# Altium project PCB-MAIN.PrjPcb (part 1 of 3)
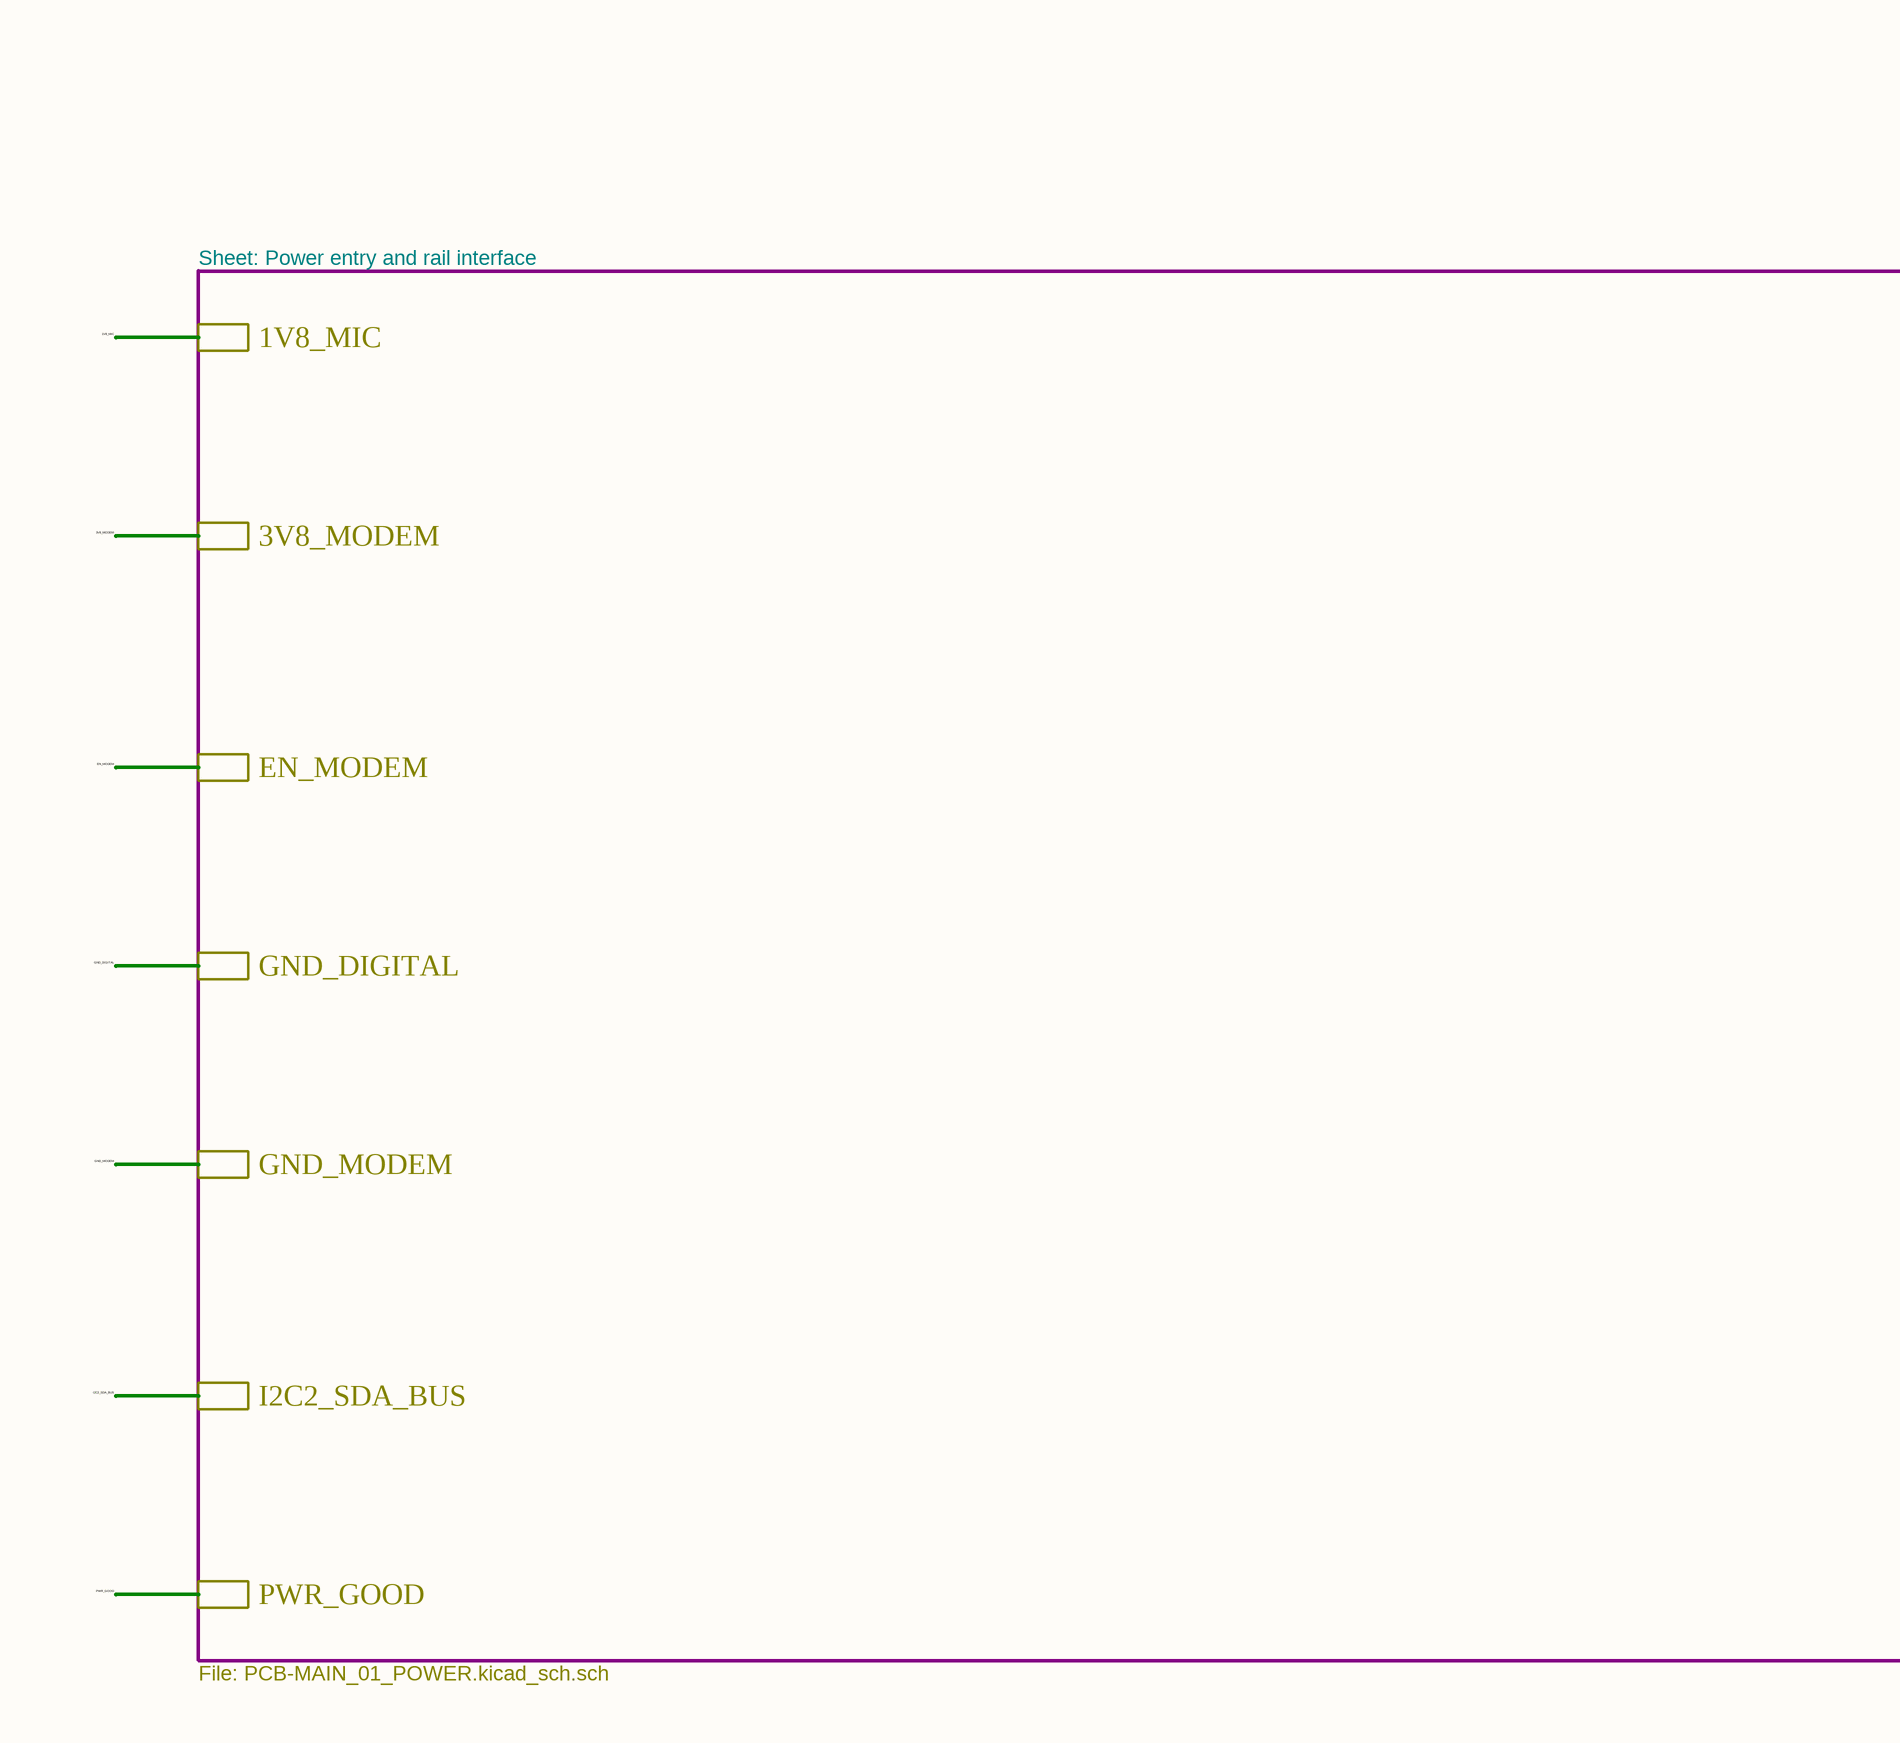
[diagram p0: PCB-MAIN.SchDoc, top column 1 of 4]
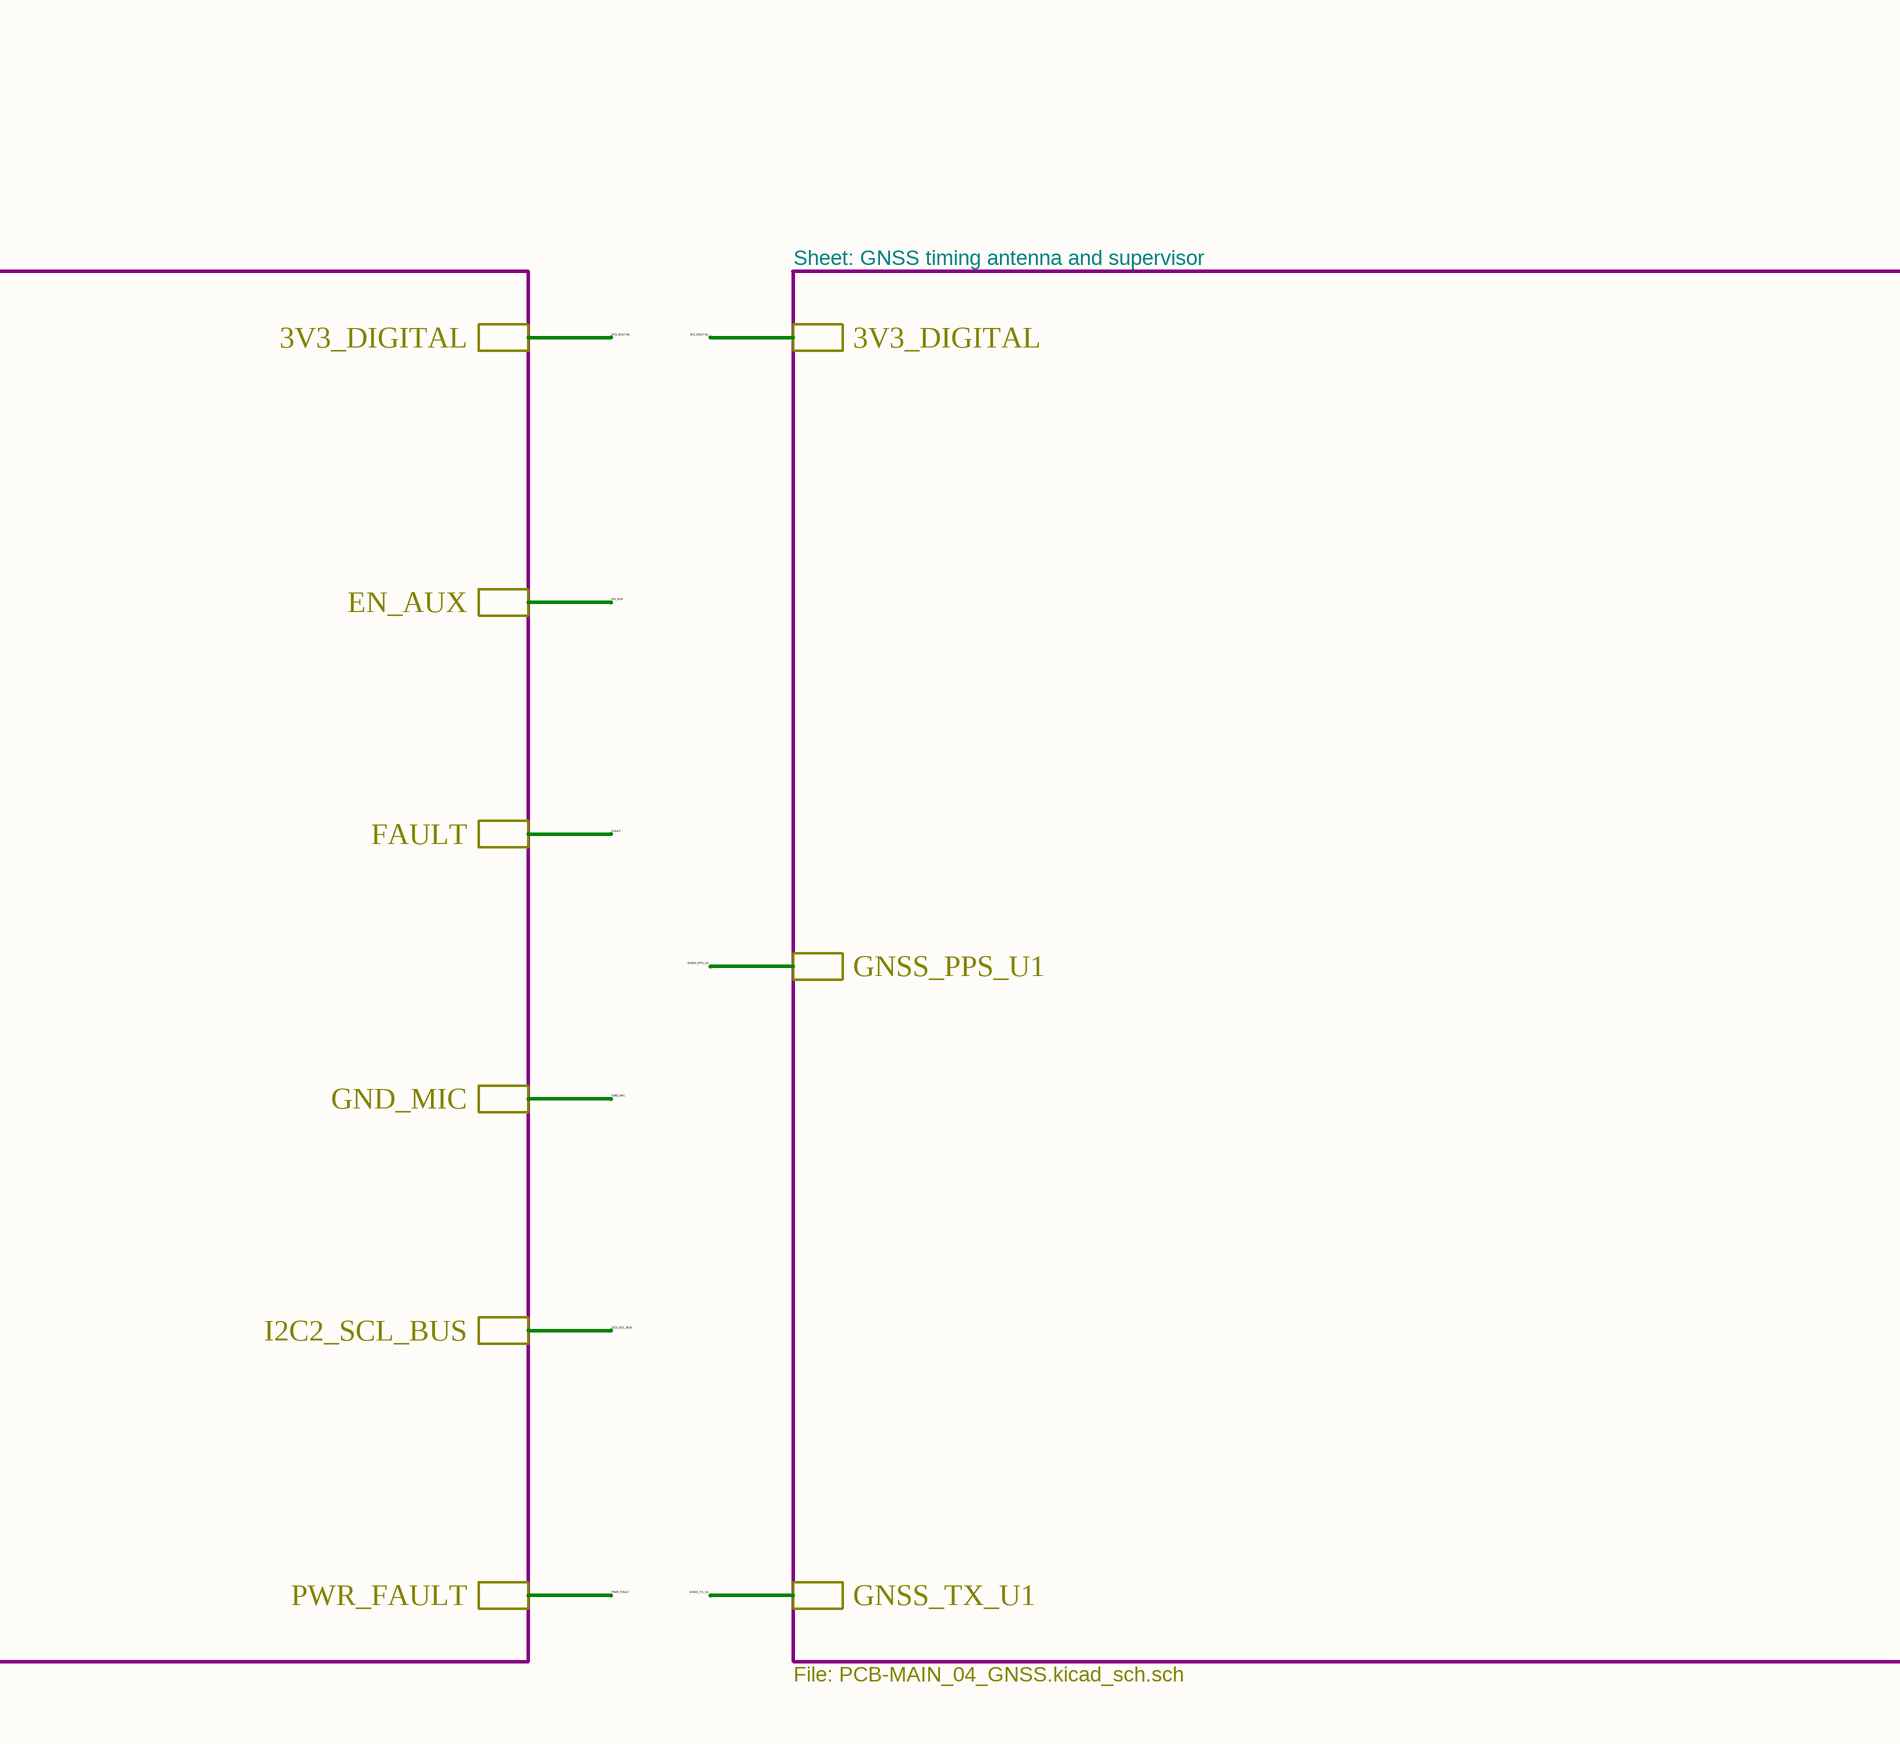
[diagram p1: PCB-MAIN.SchDoc, top column 2 of 4]
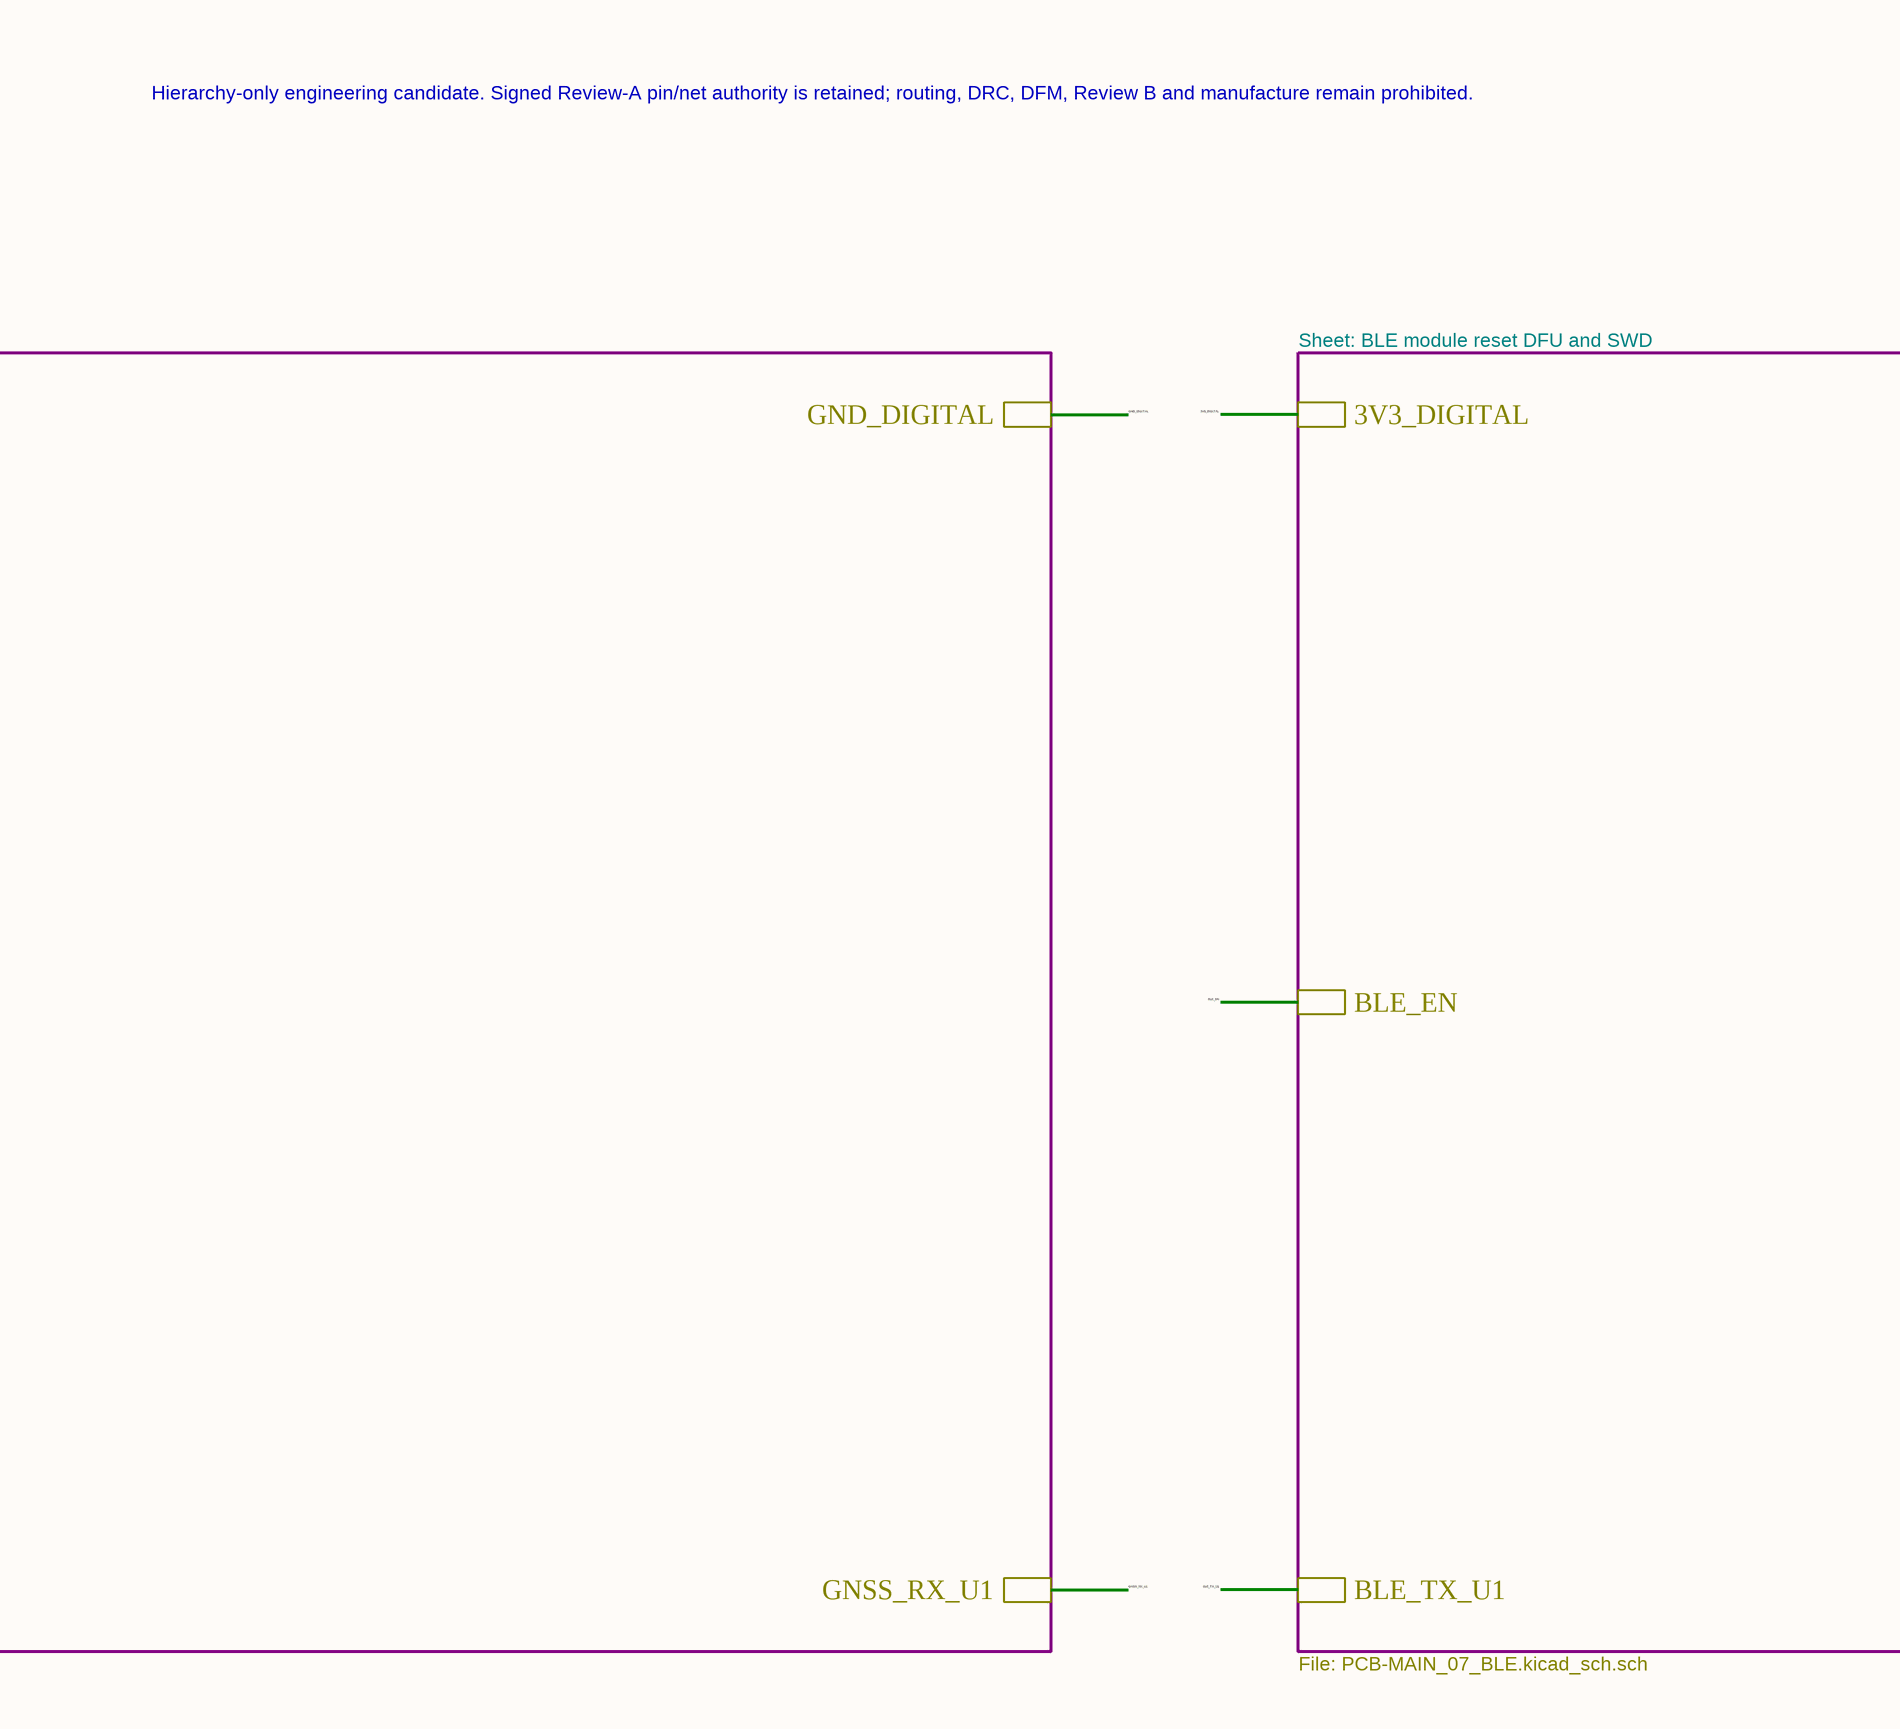
[diagram p2: PCB-MAIN.SchDoc, top column 3 of 4]
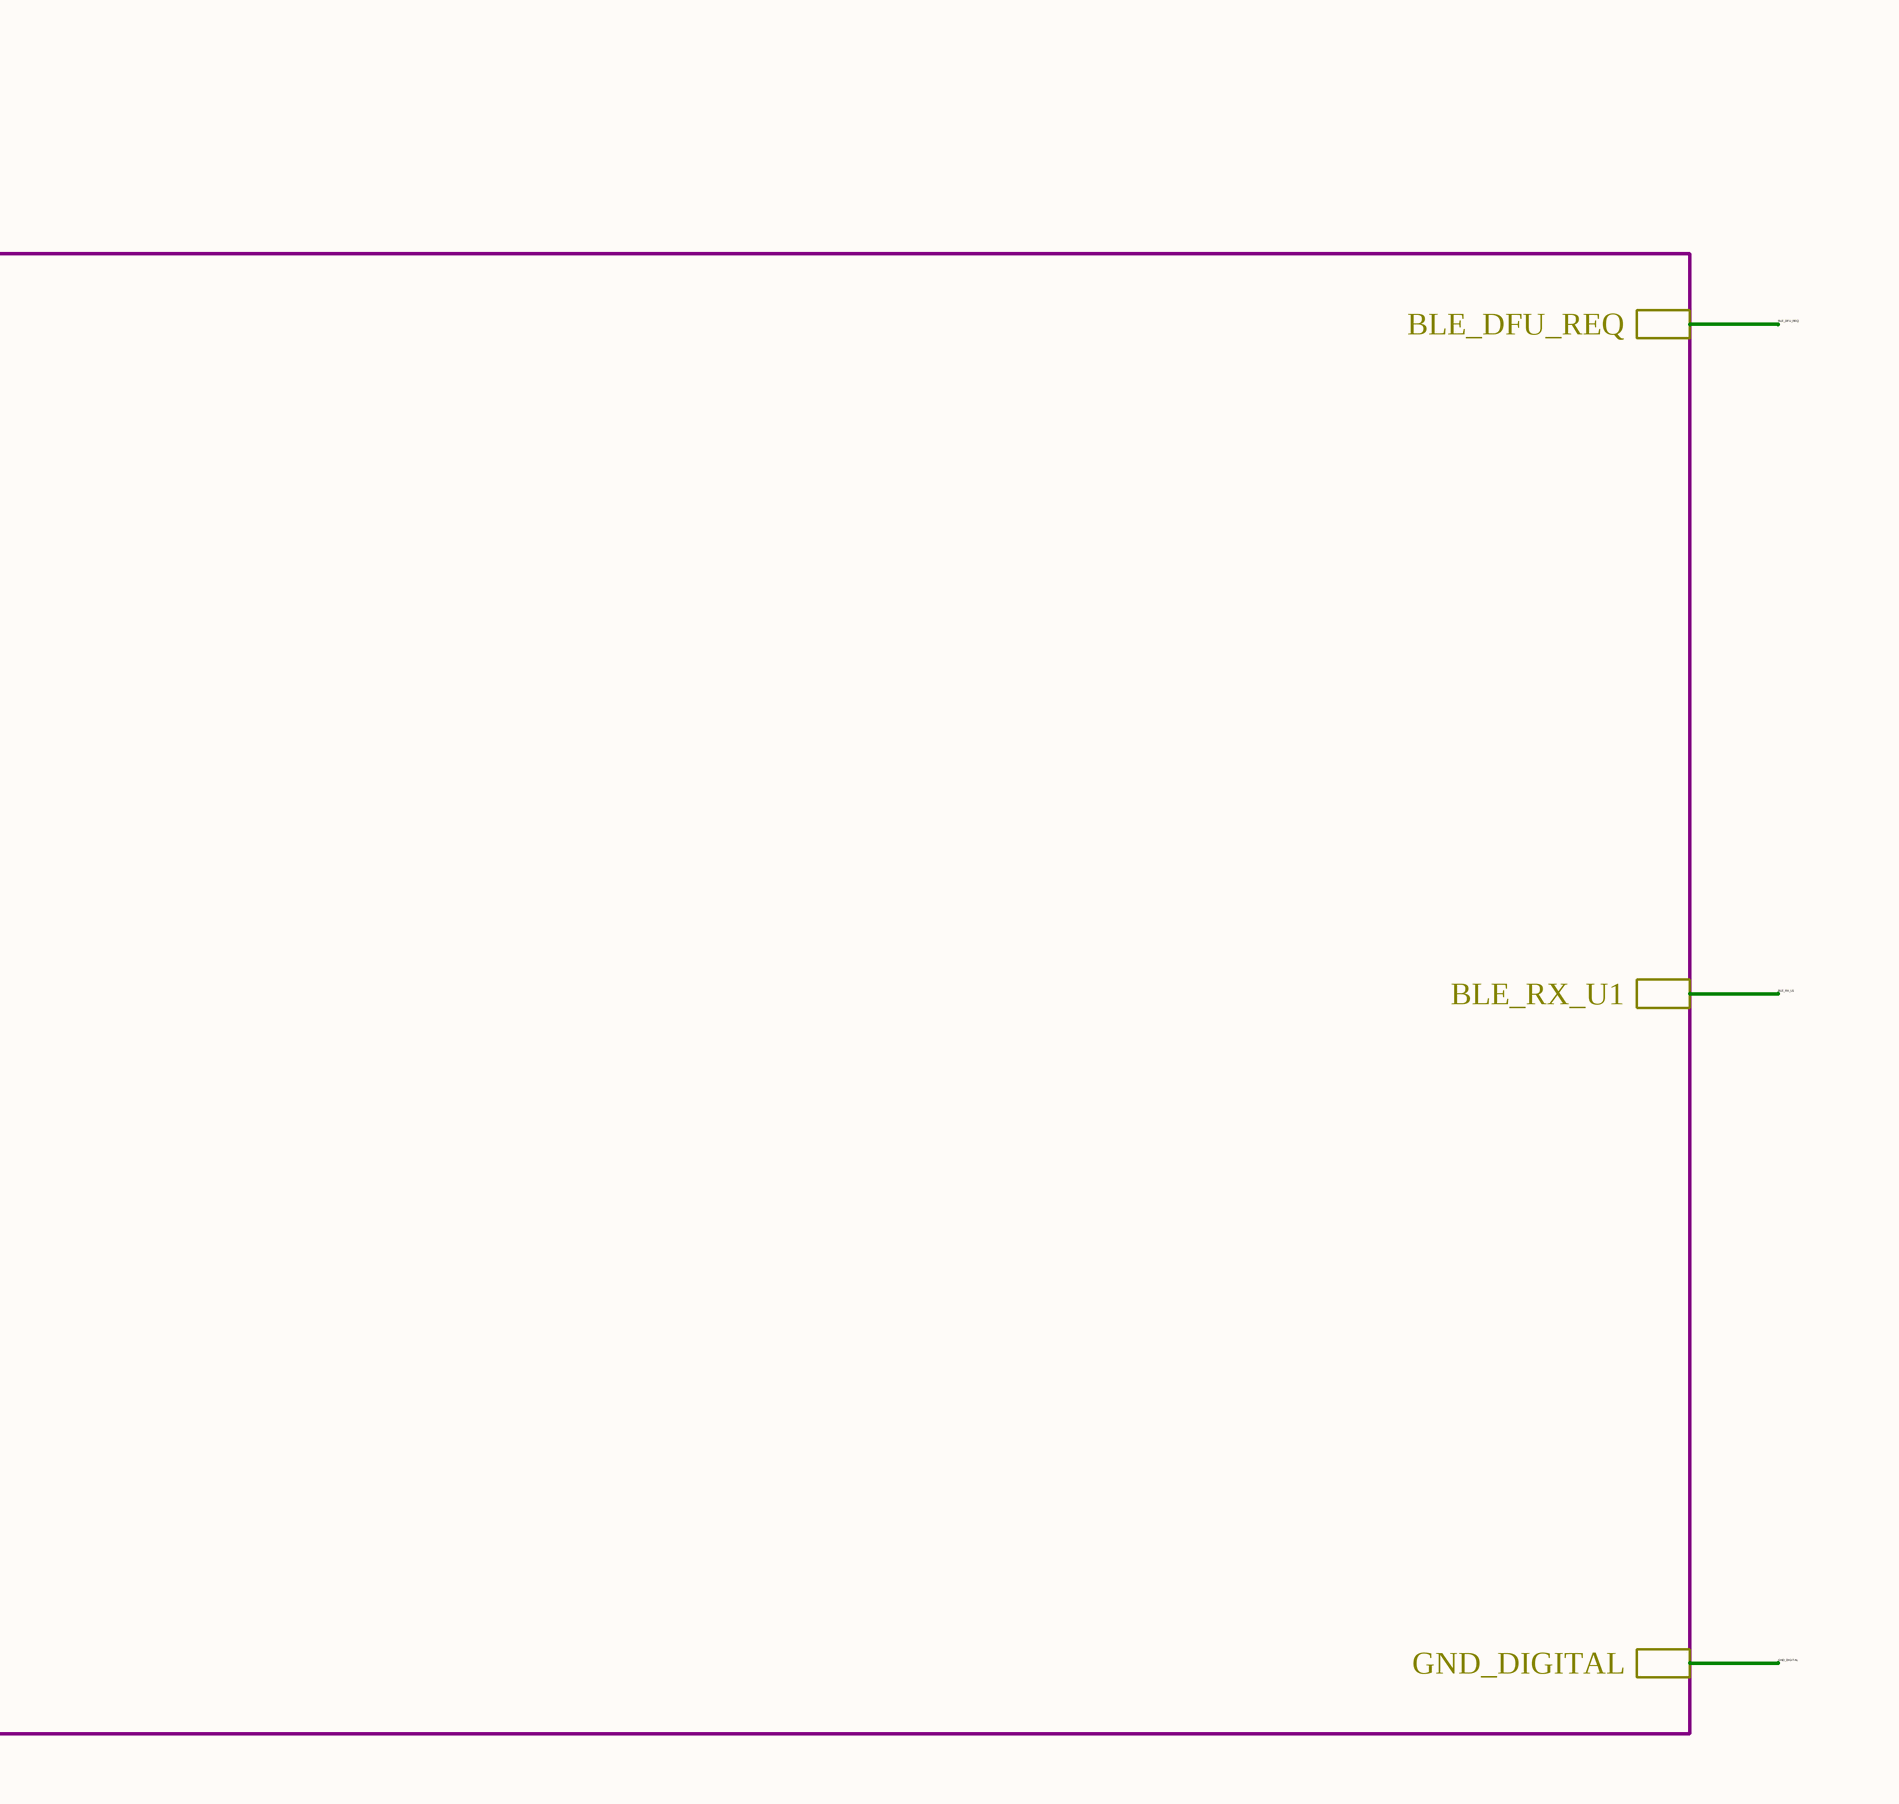
[diagram p3: PCB-MAIN.SchDoc, top column 4 of 4]
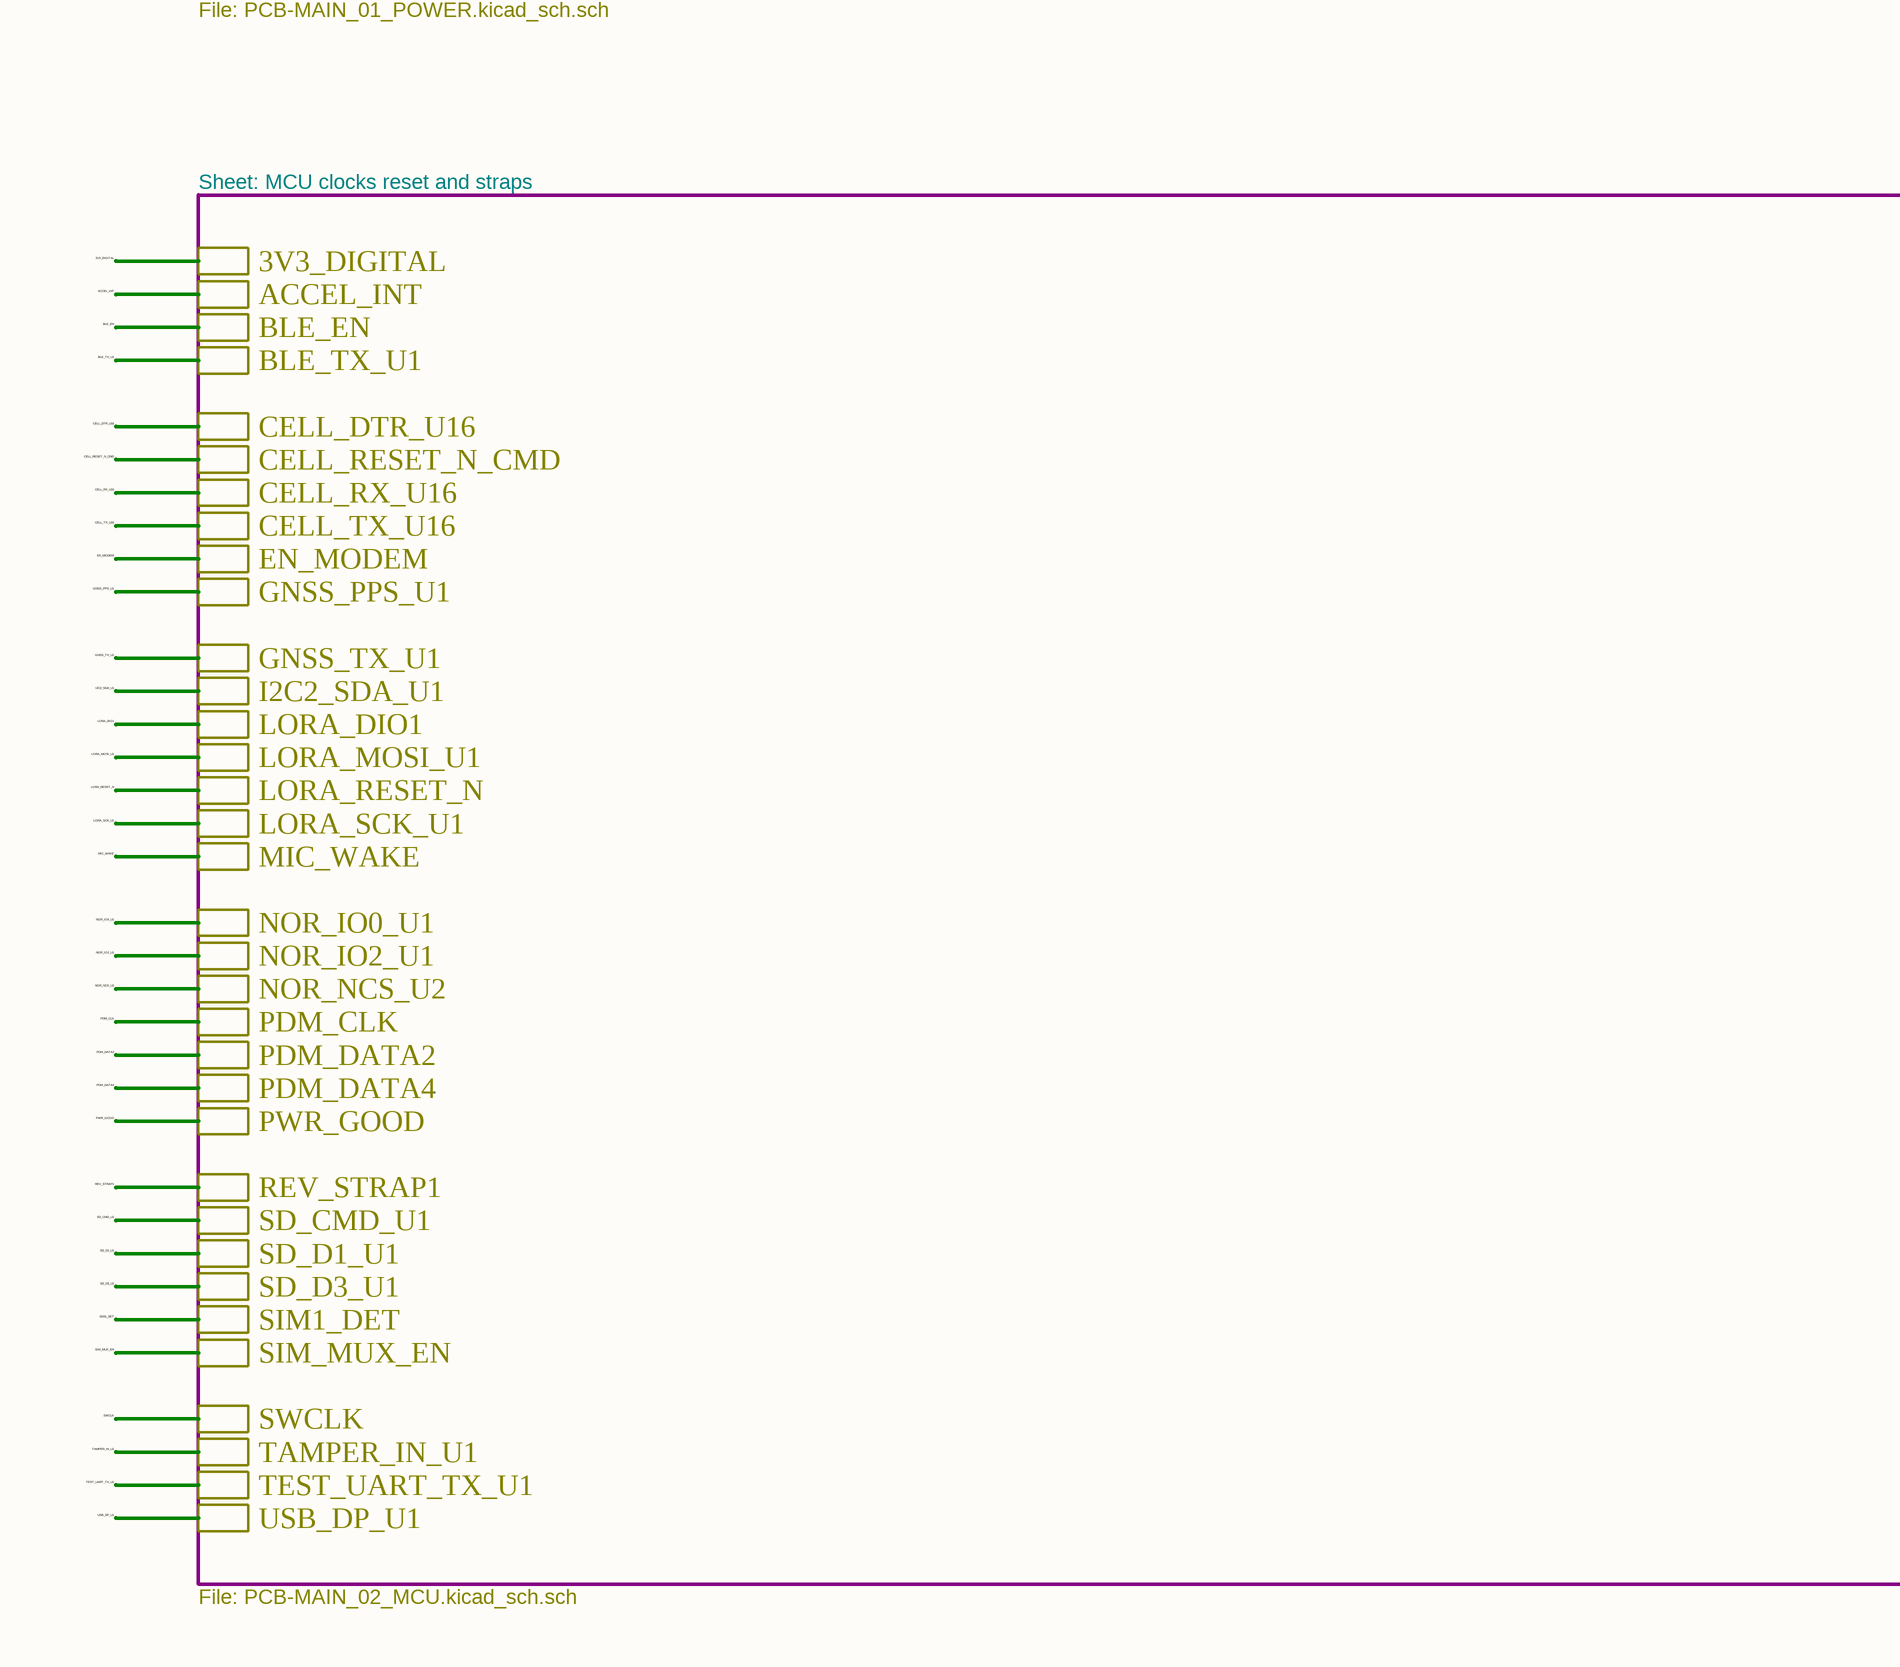
[diagram p4: PCB-MAIN.SchDoc, centre column 1 of 4]
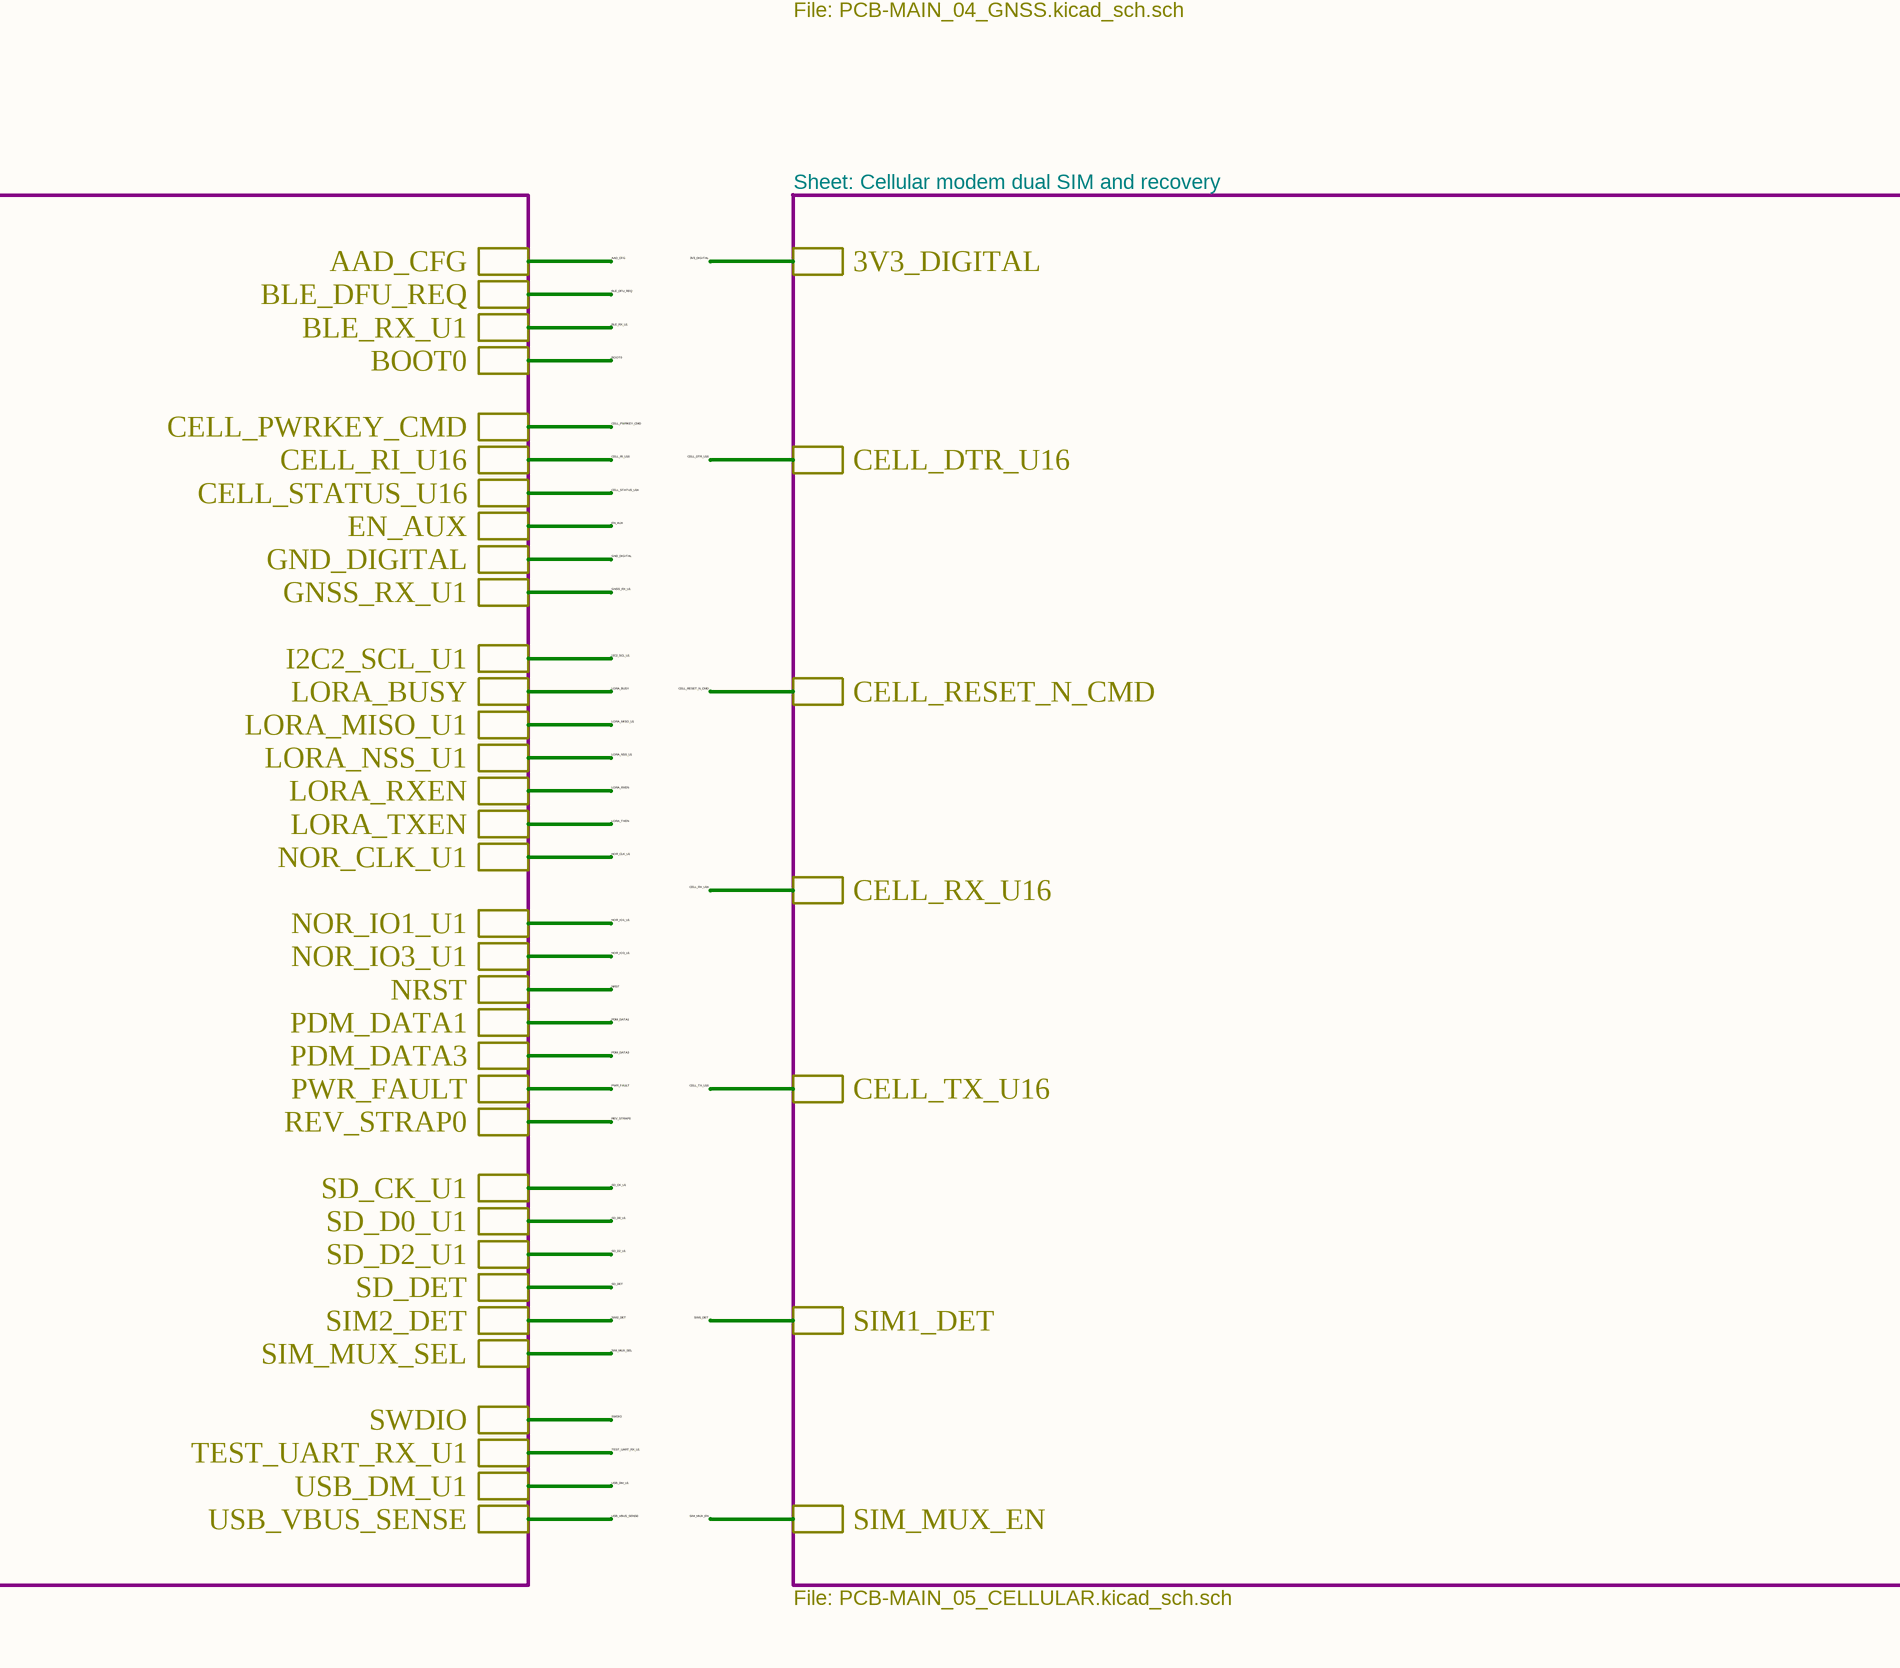
[diagram p5: PCB-MAIN.SchDoc, centre column 2 of 4]
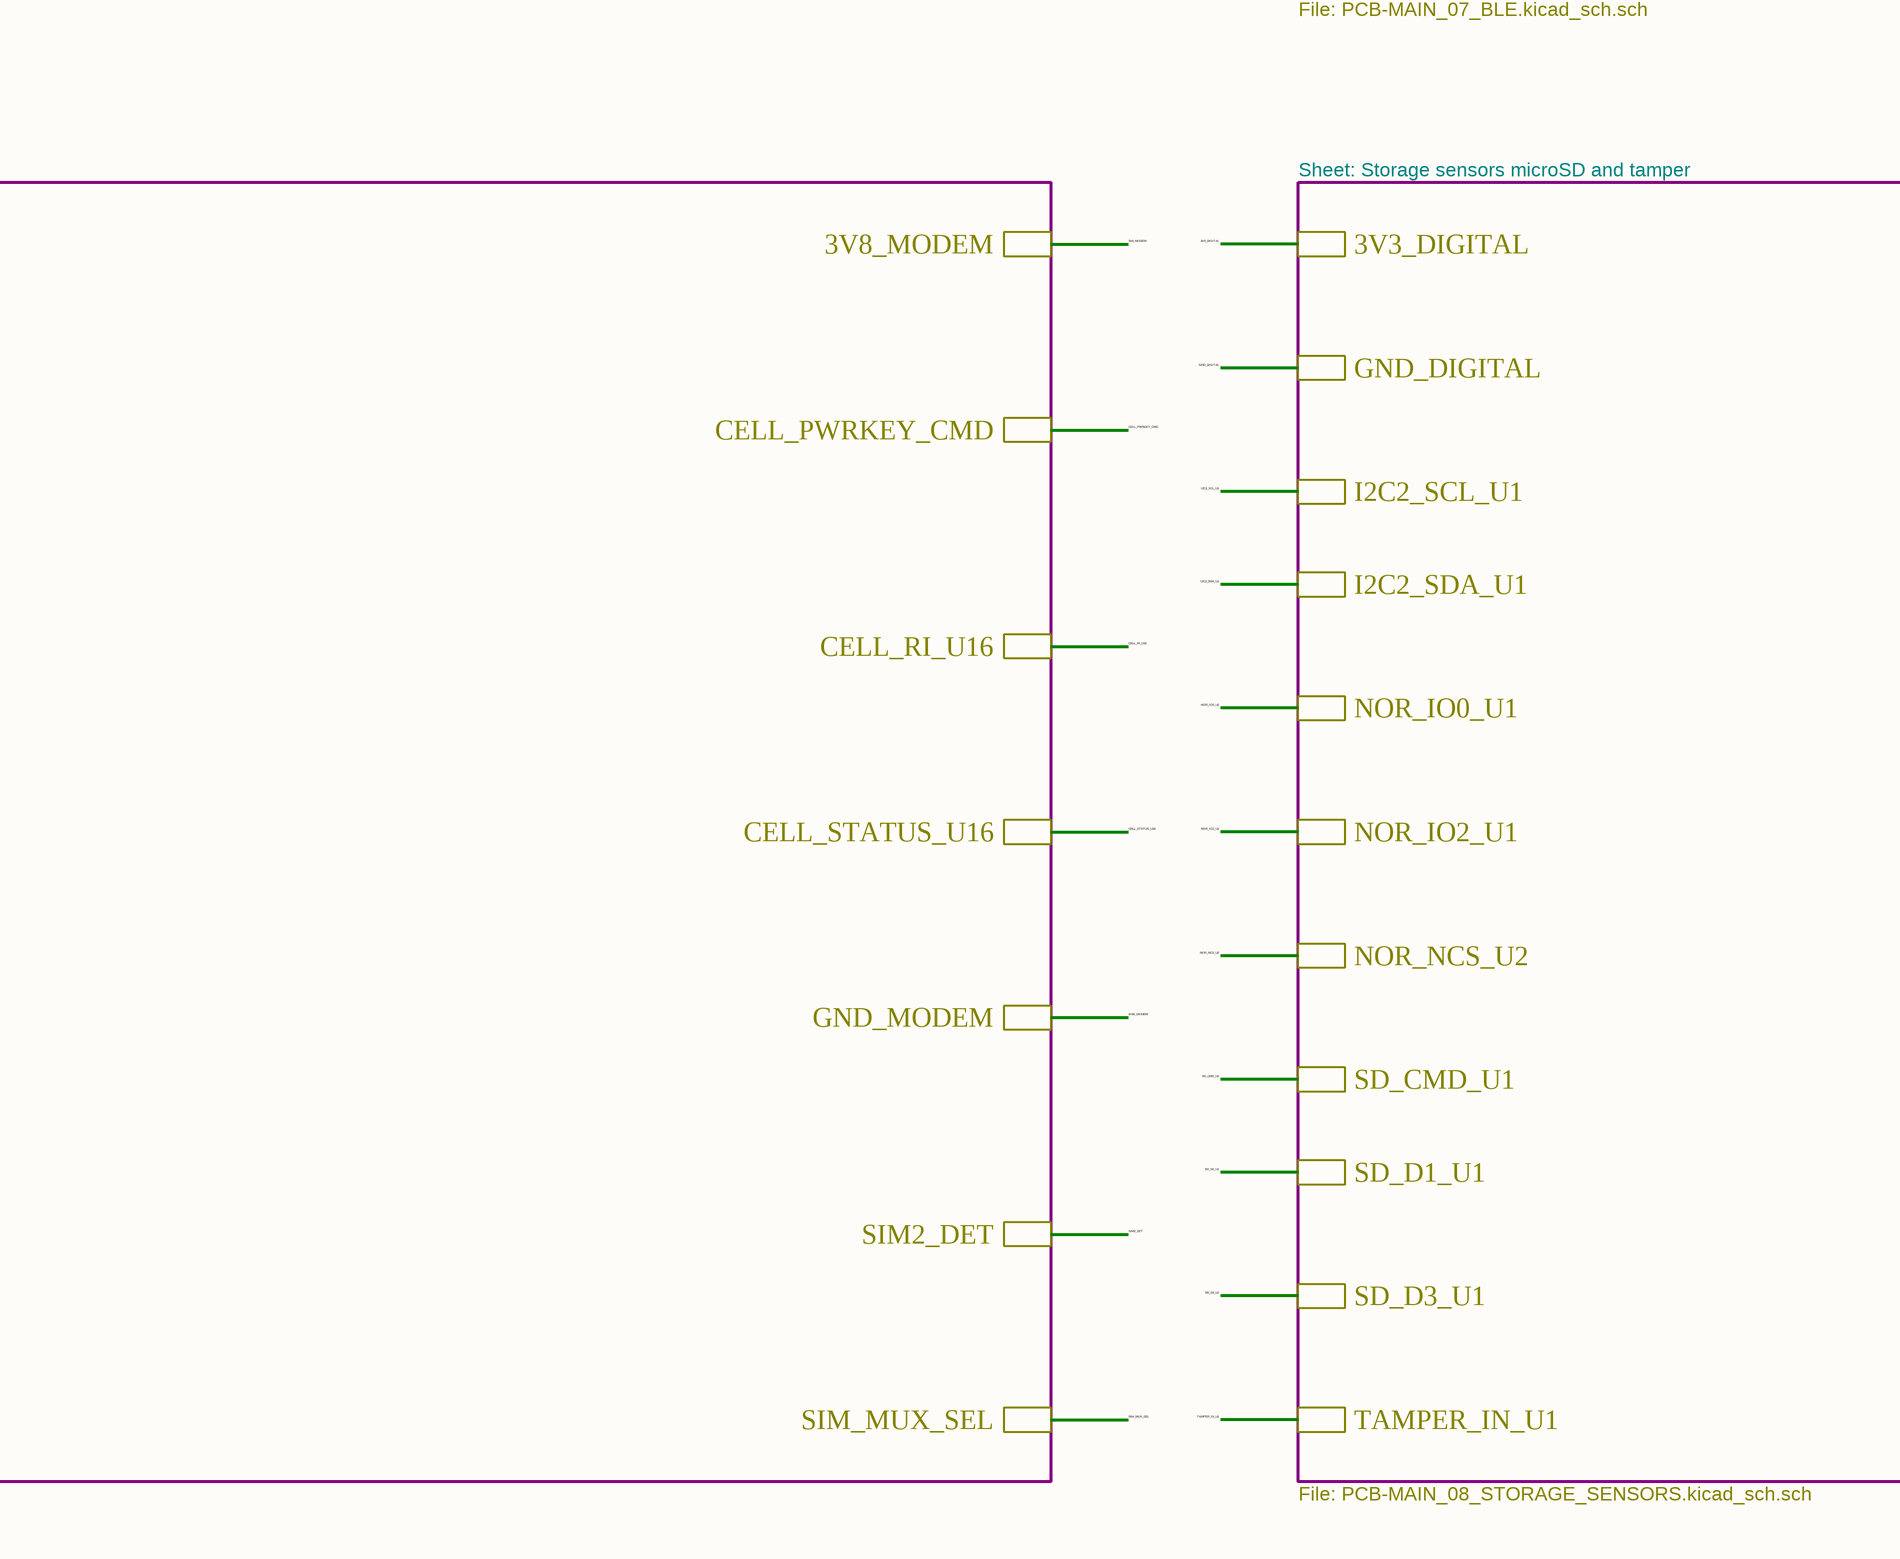
[diagram p6: PCB-MAIN.SchDoc, centre column 3 of 4]
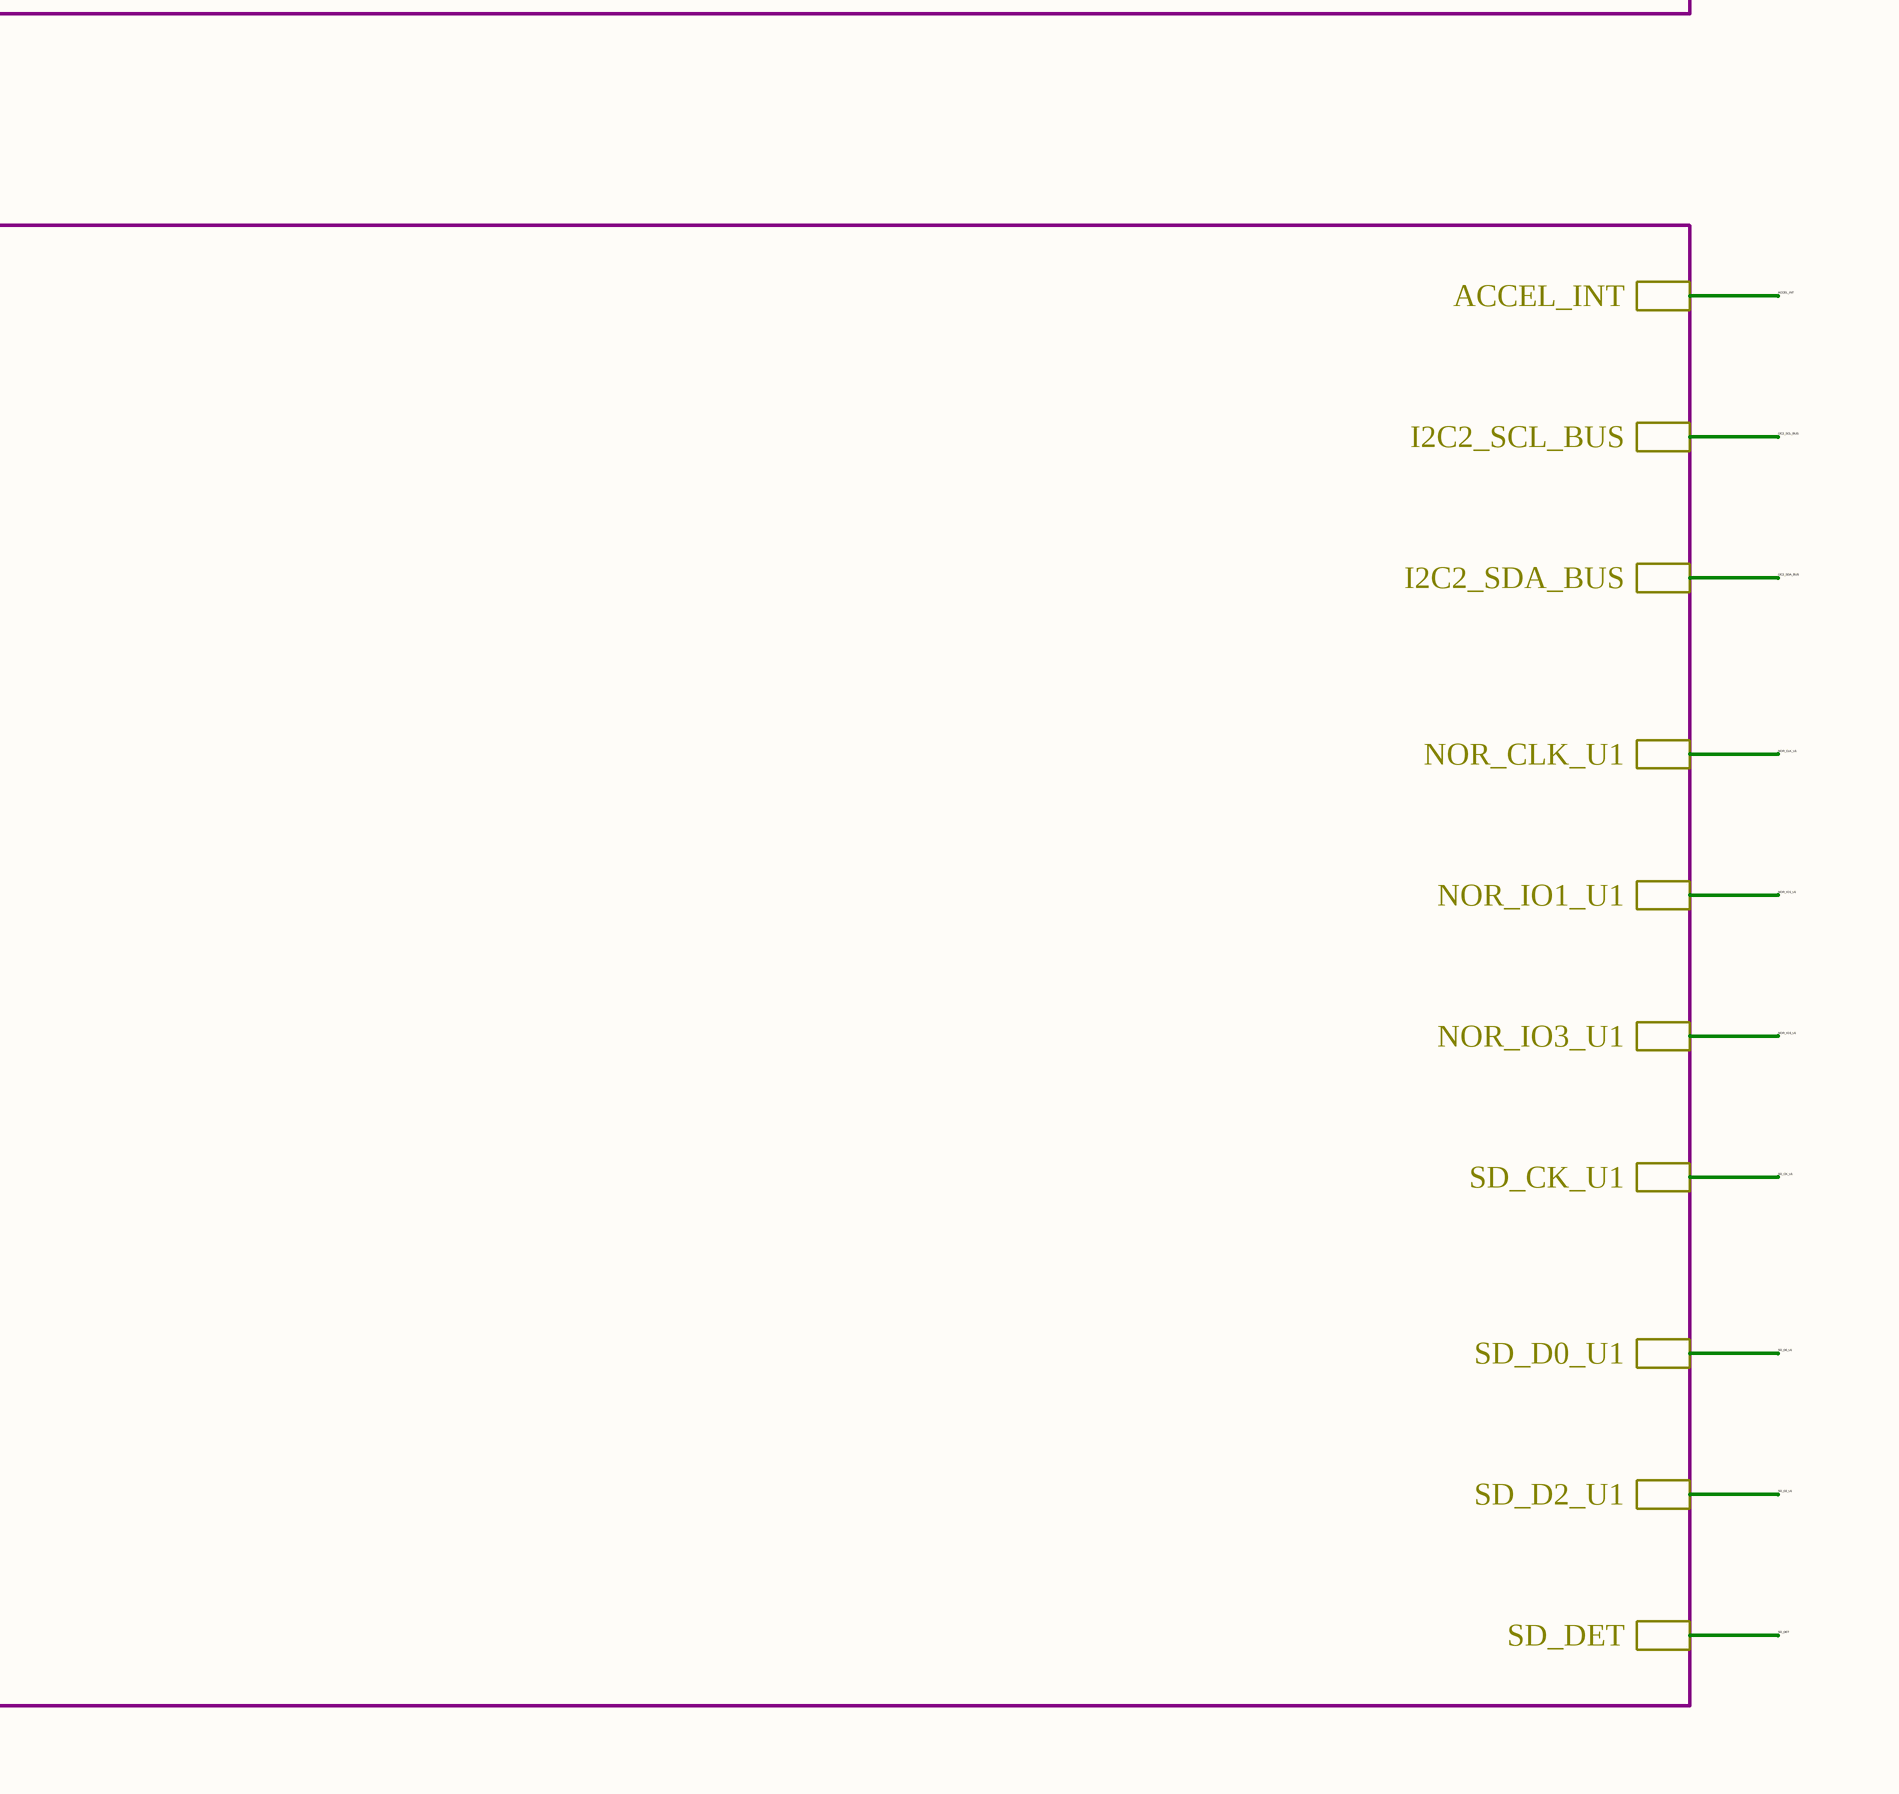
[diagram p7: PCB-MAIN.SchDoc, centre column 4 of 4]
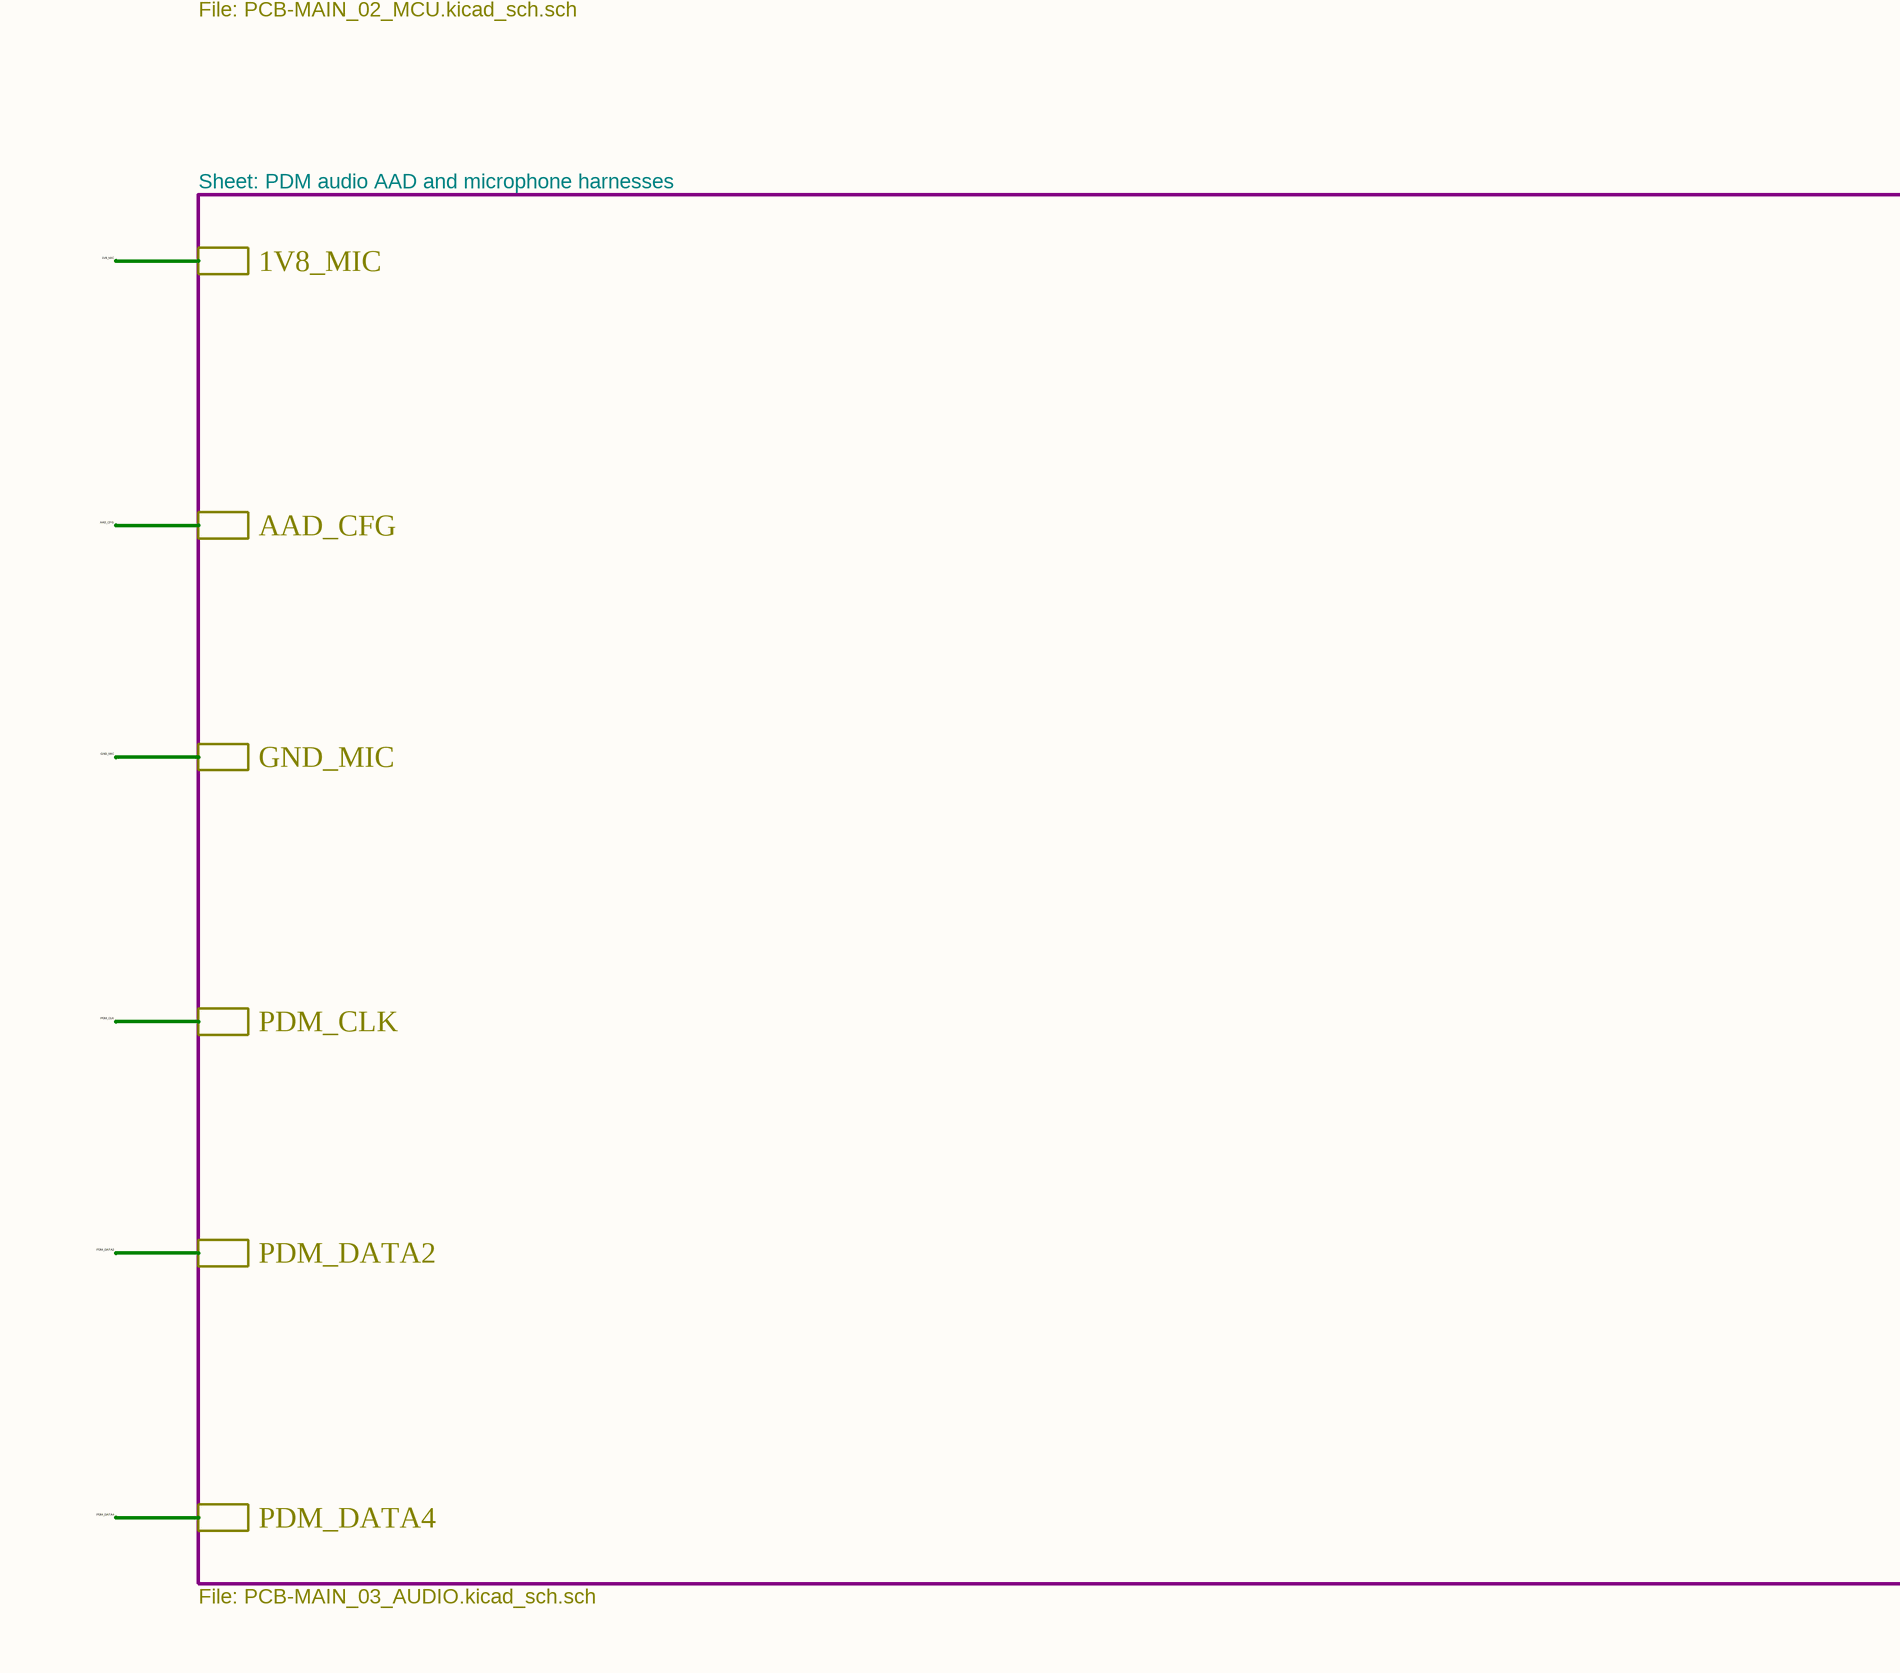
[diagram p8: PCB-MAIN.SchDoc, bottom column 1 of 4]
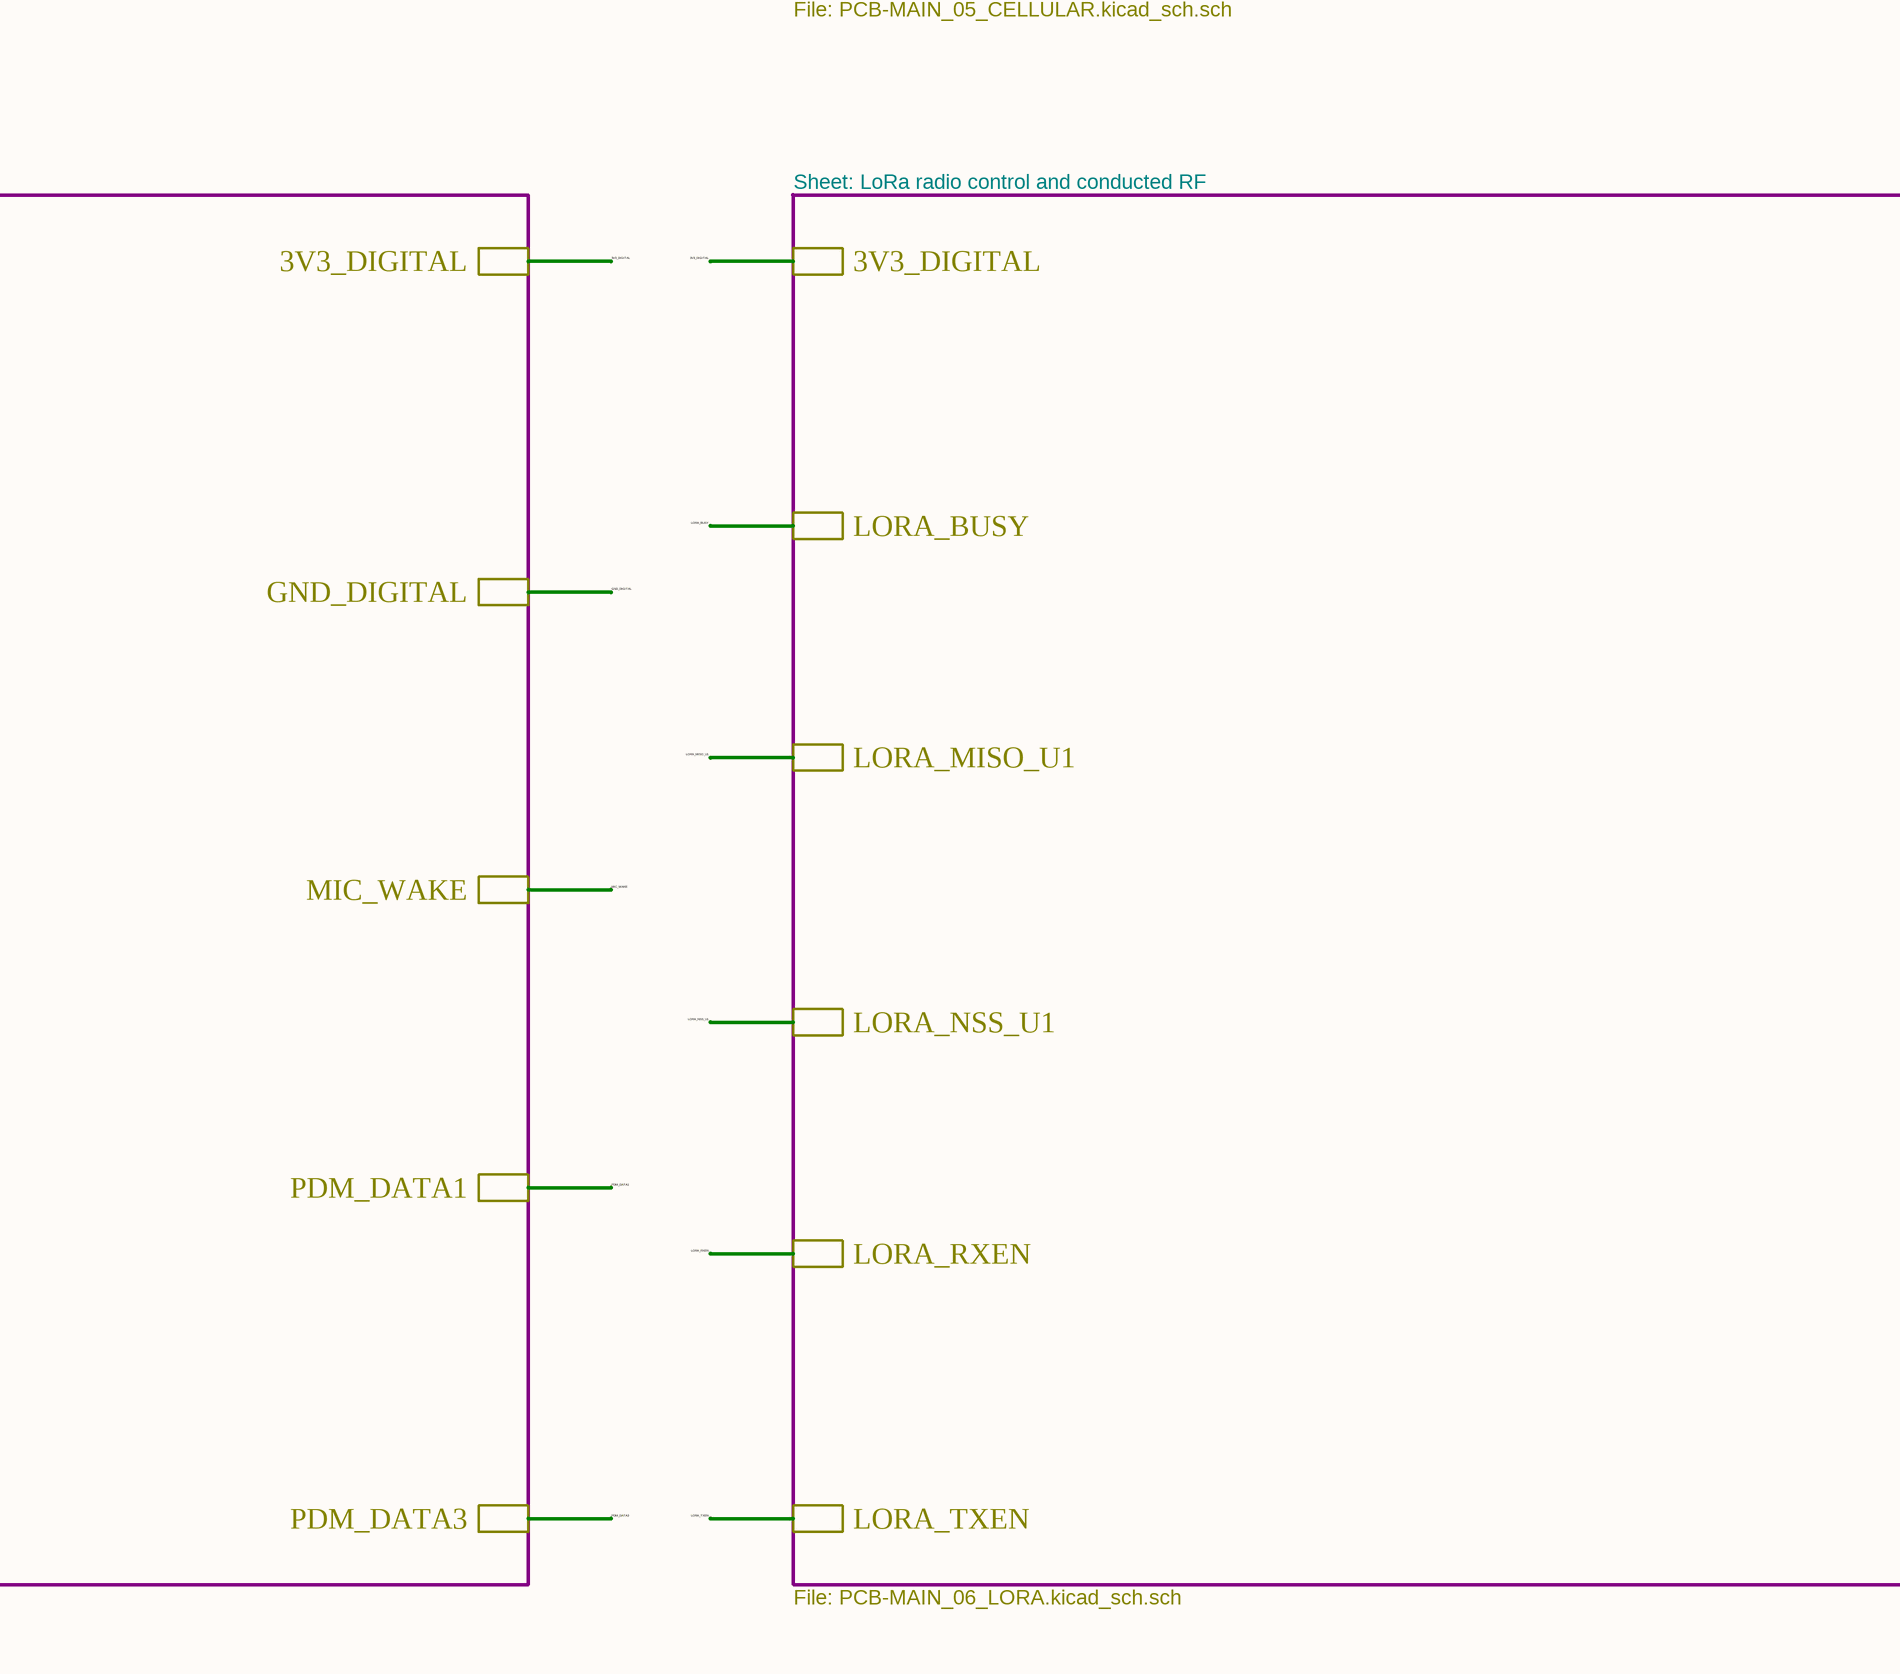
[diagram p9: PCB-MAIN.SchDoc, bottom column 2 of 4]
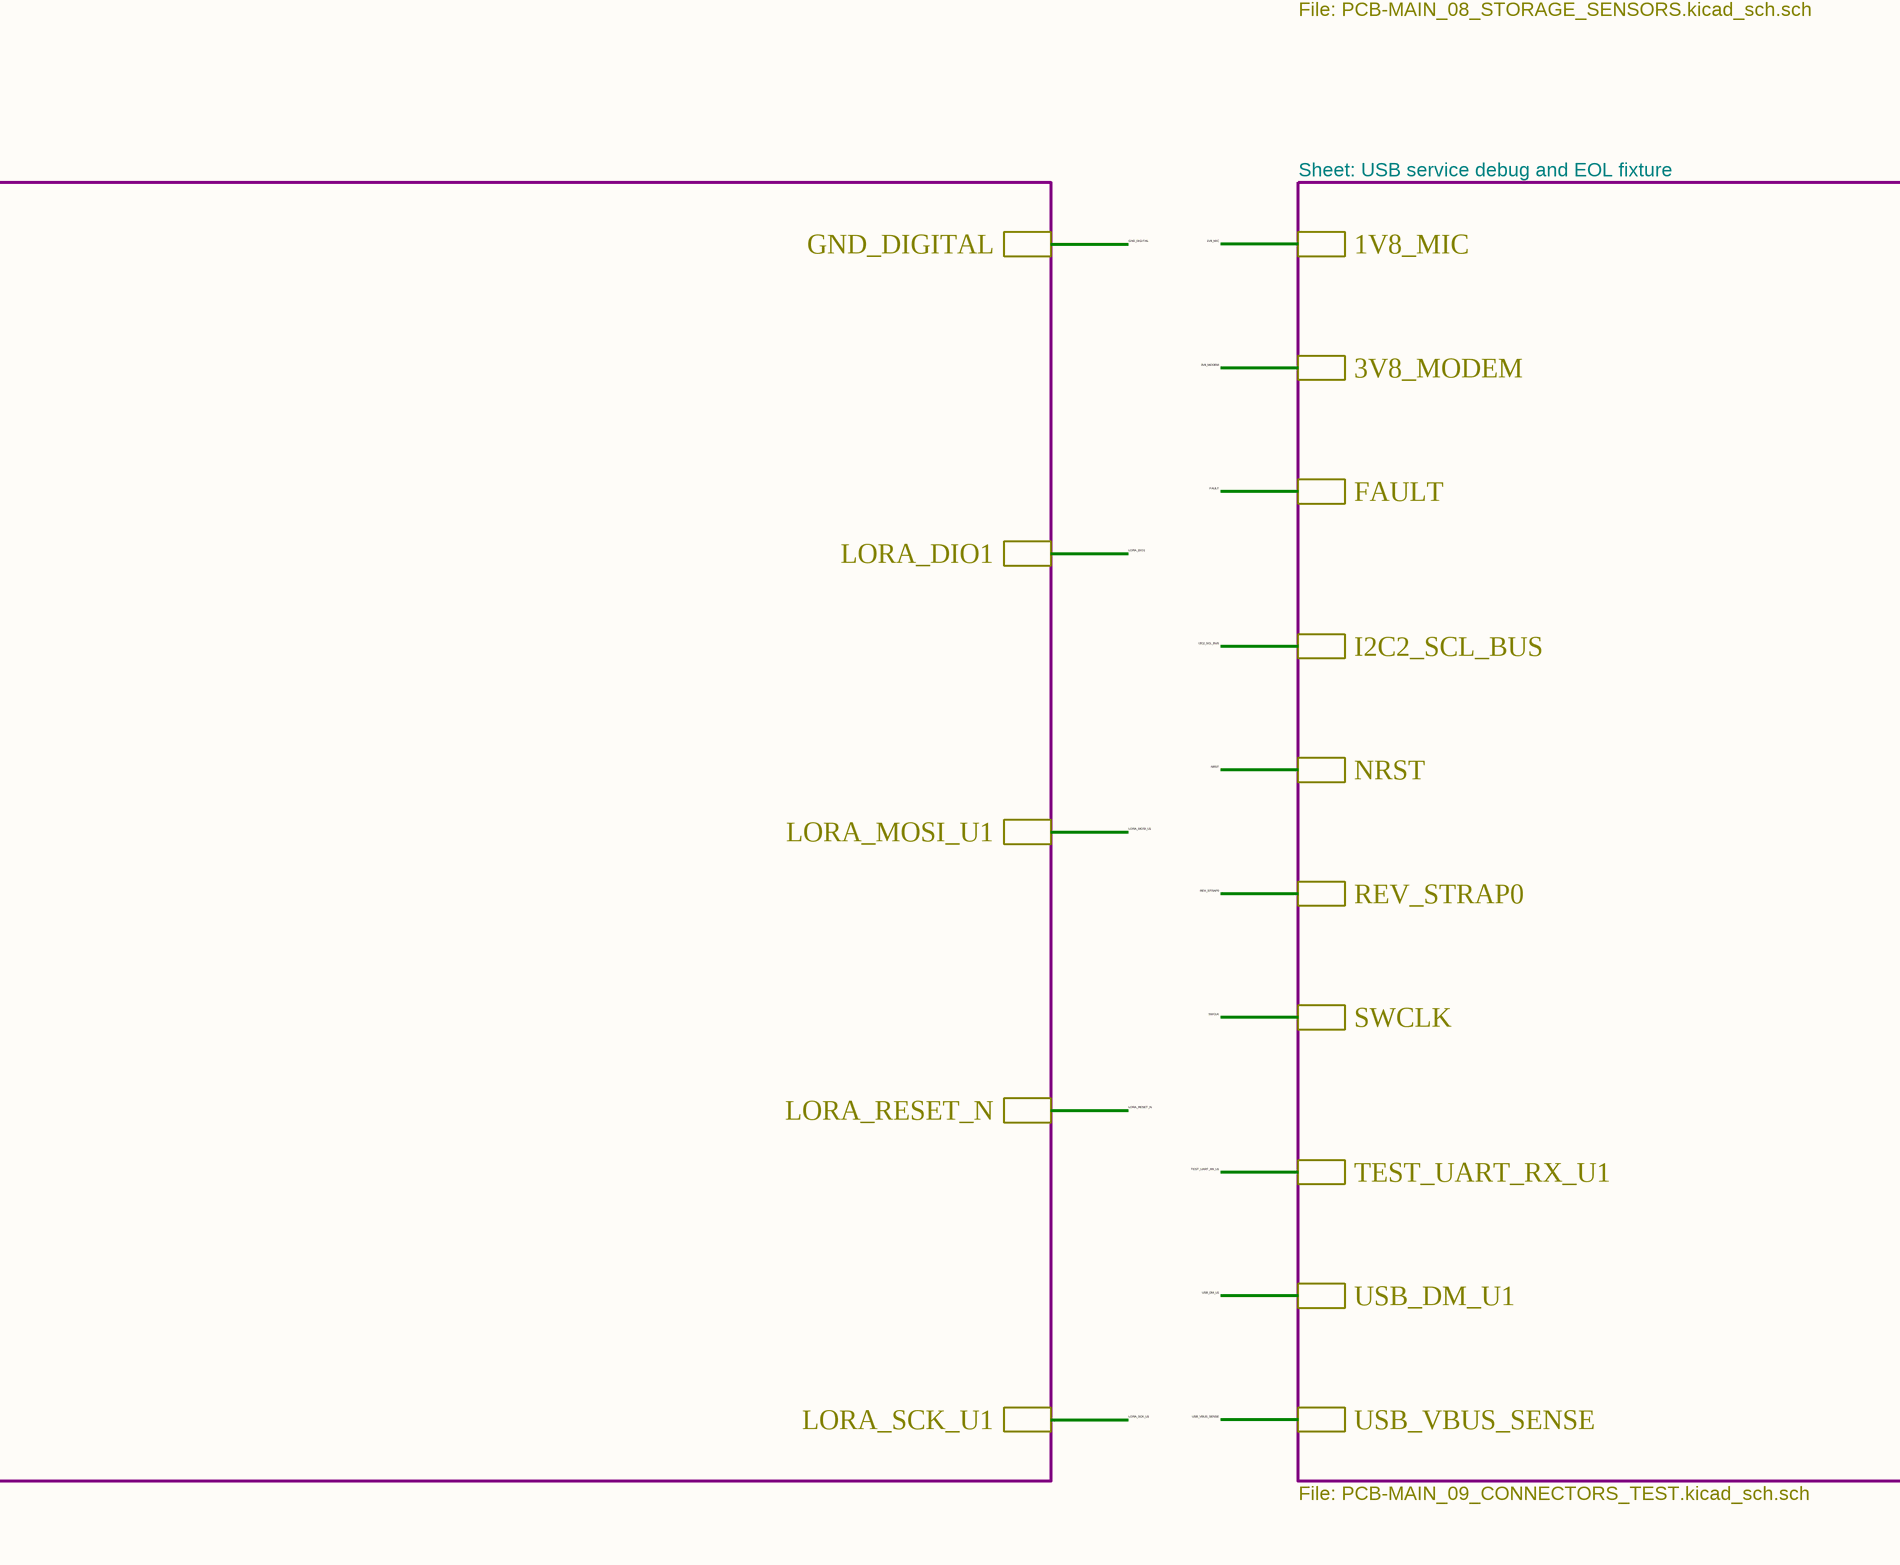
[diagram p10: PCB-MAIN.SchDoc, bottom column 3 of 4]
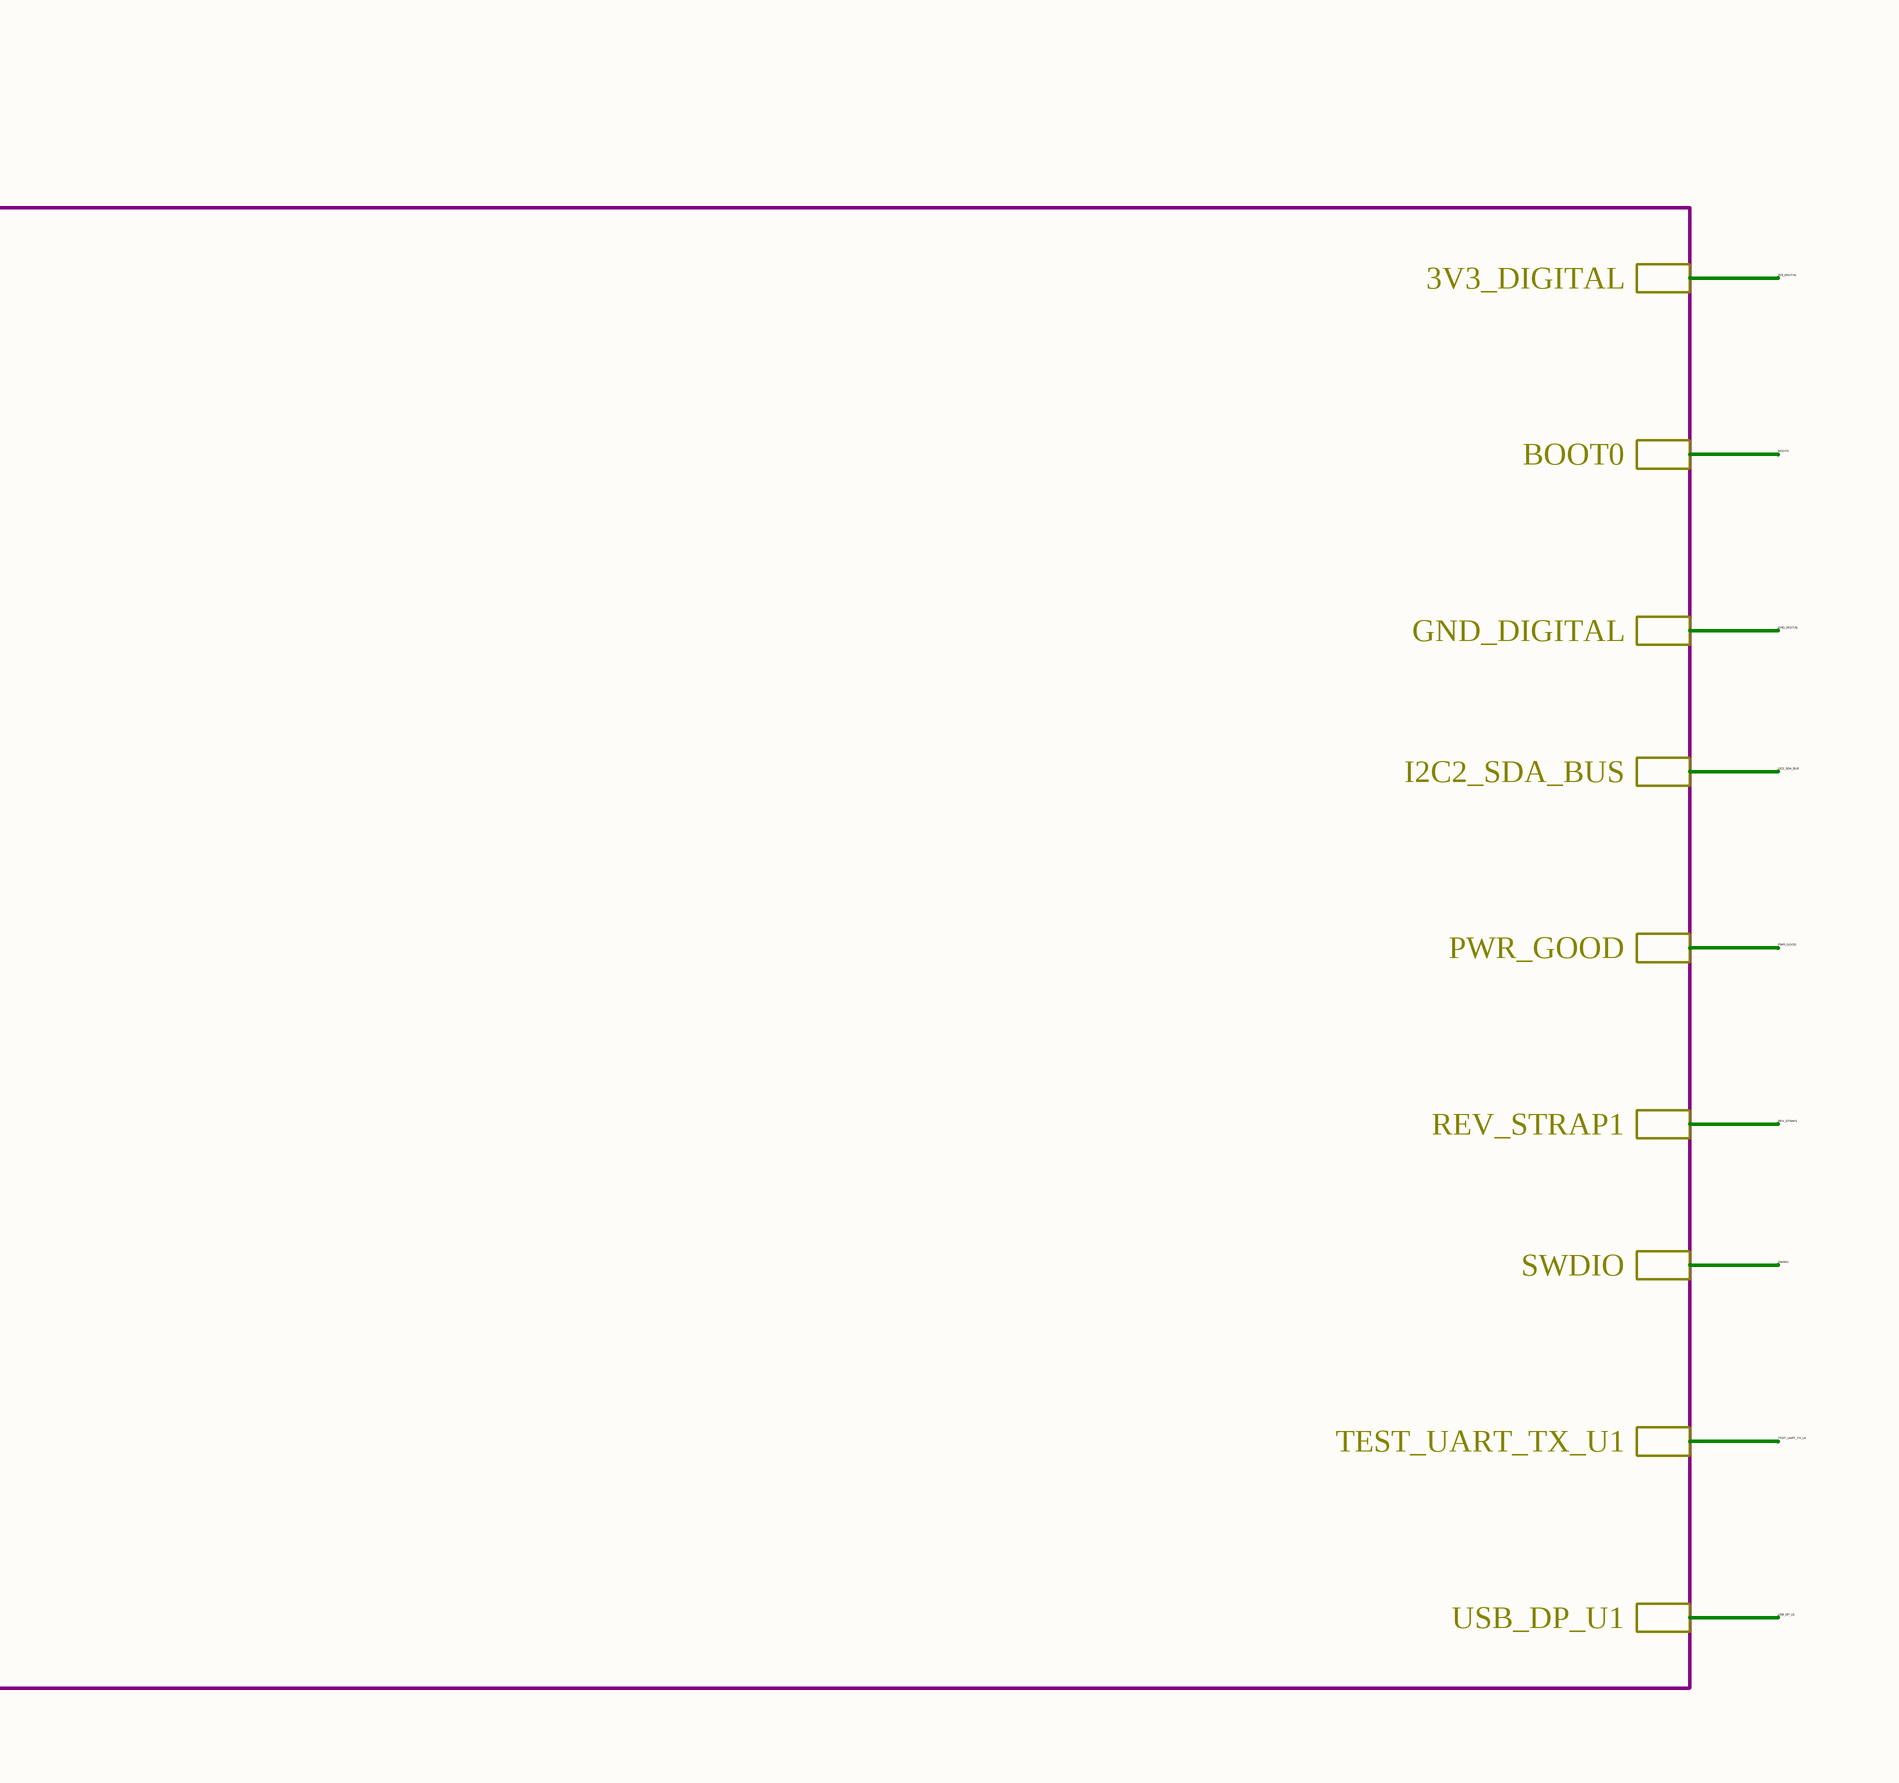
[diagram p11: PCB-MAIN.SchDoc, bottom column 4 of 4]
10 sheets, 248 parts. Net scope: strictly hierarchical (ports join the sheet entries above them; power ports are local).
Board file: PCB-MAIN.PcbDoc
Sheets:
  PCB-MAIN.SchDoc
    Power entry and rail interface = PCB-MAIN_01_POWER.SchDoc
    MCU clocks reset and straps = PCB-MAIN_02_MCU.SchDoc
    PDM audio AAD and microphone harnesses = PCB-MAIN_03_AUDIO.SchDoc
    GNSS timing antenna and supervisor = PCB-MAIN_04_GNSS.SchDoc
    Cellular modem dual SIM and recovery = PCB-MAIN_05_CELLULAR.SchDoc
    LoRa radio control and conducted RF = PCB-MAIN_06_LORA.SchDoc
    BLE module reset DFU and SWD = PCB-MAIN_07_BLE.SchDoc
    Storage sensors microSD and tamper = PCB-MAIN_08_STORAGE_SENSORS.SchDoc
    USB service debug and EOL fixture = PCB-MAIN_09_CONNECTORS_TEST.SchDoc

## Sheet PCB-MAIN.SchDoc
size 594 x 420 mm

### Sub-sheets
BLE module reset DFU and SWD = PCB-MAIN_07_BLE.SchDoc: 3V3_DIGITAL, BLE_EN, BLE_TX_U1, BLE_DFU_REQ, BLE_RX_U1, GND_DIGITAL
Cellular modem dual SIM and recovery = PCB-MAIN_05_CELLULAR.SchDoc: 3V3_DIGITAL, CELL_DTR_U16, CELL_RESET_N_CMD, CELL_RX_U16, CELL_TX_U16, SIM1_DET, SIM_MUX_EN, 3V8_MODEM, CELL_PWRKEY_CMD, CELL_RI_U16, CELL_STATUS_U16, GND_MODEM, SIM2_DET, SIM_MUX_SEL
GNSS timing antenna and supervisor = PCB-MAIN_04_GNSS.SchDoc: 3V3_DIGITAL, GNSS_PPS_U1, GNSS_TX_U1, GND_DIGITAL, GNSS_RX_U1
LoRa radio control and conducted RF = PCB-MAIN_06_LORA.SchDoc: 3V3_DIGITAL, LORA_BUSY, LORA_MISO_U1, LORA_NSS_U1, LORA_RXEN, LORA_TXEN, GND_DIGITAL, LORA_DIO1, LORA_MOSI_U1, LORA_RESET_N, LORA_SCK_U1
MCU clocks reset and straps = PCB-MAIN_02_MCU.SchDoc: 3V3_DIGITAL, ACCEL_INT, BLE_EN, BLE_TX_U1, CELL_DTR_U16, CELL_RESET_N_CMD, CELL_RX_U16, CELL_TX_U16, EN_MODEM, GNSS_PPS_U1, GNSS_TX_U1, I2C2_SDA_U1, LORA_DIO1, LORA_MOSI_U1, LORA_RESET_N, LORA_SCK_U1, MIC_WAKE, NOR_IO0_U1, NOR_IO2_U1, NOR_NCS_U2, PDM_CLK, PDM_DATA2, PDM_DATA4, PWR_GOOD, REV_STRAP1, SD_CMD_U1, SD_D1_U1, SD_D3_U1, SIM1_DET, SIM_MUX_EN, SWCLK, TAMPER_IN_U1, TEST_UART_TX_U1, USB_DP_U1, AAD_CFG, BLE_DFU_REQ, BLE_RX_U1, BOOT0, CELL_PWRKEY_CMD, CELL_RI_U16, CELL_STATUS_U16, EN_AUX, GND_DIGITAL, GNSS_RX_U1, I2C2_SCL_U1, LORA_BUSY, LORA_MISO_U1, LORA_NSS_U1, LORA_RXEN, LORA_TXEN, NOR_CLK_U1, NOR_IO1_U1, NOR_IO3_U1, NRST, PDM_DATA1, PDM_DATA3, PWR_FAULT, REV_STRAP0, SD_CK_U1, SD_D0_U1, SD_D2_U1, SD_DET, SIM2_DET, SIM_MUX_SEL, SWDIO, TEST_UART_RX_U1, USB_DM_U1, USB_VBUS_SENSE
PDM audio AAD and microphone harnesses = PCB-MAIN_03_AUDIO.SchDoc: 1V8_MIC, AAD_CFG, GND_MIC, PDM_CLK, PDM_DATA2, PDM_DATA4, 3V3_DIGITAL, GND_DIGITAL, MIC_WAKE, PDM_DATA1, PDM_DATA3
Power entry and rail interface = PCB-MAIN_01_POWER.SchDoc: 1V8_MIC, 3V8_MODEM, EN_MODEM, GND_DIGITAL, GND_MODEM, I2C2_SDA_BUS, PWR_GOOD, 3V3_DIGITAL, EN_AUX, FAULT, GND_MIC, I2C2_SCL_BUS, PWR_FAULT
Storage sensors microSD and tamper = PCB-MAIN_08_STORAGE_SENSORS.SchDoc: 3V3_DIGITAL, GND_DIGITAL, I2C2_SCL_U1, I2C2_SDA_U1, NOR_IO0_U1, NOR_IO2_U1, NOR_NCS_U2, SD_CMD_U1, SD_D1_U1, SD_D3_U1, TAMPER_IN_U1, ACCEL_INT, I2C2_SCL_BUS, I2C2_SDA_BUS, NOR_CLK_U1, NOR_IO1_U1, NOR_IO3_U1, SD_CK_U1, SD_D0_U1, SD_D2_U1, SD_DET
USB service debug and EOL fixture = PCB-MAIN_09_CONNECTORS_TEST.SchDoc: 1V8_MIC, 3V8_MODEM, FAULT, I2C2_SCL_BUS, NRST, REV_STRAP0, SWCLK, TEST_UART_RX_U1, USB_DM_U1, USB_VBUS_SENSE, 3V3_DIGITAL, BOOT0, GND_DIGITAL, I2C2_SDA_BUS, PWR_GOOD, REV_STRAP1, SWDIO, TEST_UART_TX_U1, USB_DP_U1

### Nets
1V8_MIC: sheet Power entry and rail interface/1V8_MIC, sheet PDM audio AAD and microphone harnesses/1V8_MIC, sheet USB service debug and EOL fixture/1V8_MIC
3V3_DIGITAL: sheet Power entry and rail interface/3V3_DIGITAL, sheet MCU clocks reset and straps/3V3_DIGITAL, sheet PDM audio AAD and microphone harnesses/3V3_DIGITAL, sheet GNSS timing antenna and supervisor/3V3_DIGITAL, sheet Cellular modem dual SIM and recovery/3V3_DIGITAL, sheet LoRa radio control and conducted RF/3V3_DIGITAL, sheet BLE module reset DFU and SWD/3V3_DIGITAL, sheet Storage sensors microSD and tamper/3V3_DIGITAL, sheet USB service debug and EOL fixture/3V3_DIGITAL
3V8_MODEM: sheet Power entry and rail interface/3V8_MODEM, sheet Cellular modem dual SIM and recovery/3V8_MODEM, sheet USB service debug and EOL fixture/3V8_MODEM
AAD_CFG: sheet MCU clocks reset and straps/AAD_CFG, sheet PDM audio AAD and microphone harnesses/AAD_CFG
ACCEL_INT: sheet MCU clocks reset and straps/ACCEL_INT, sheet Storage sensors microSD and tamper/ACCEL_INT
BLE_DFU_REQ: sheet MCU clocks reset and straps/BLE_DFU_REQ, sheet BLE module reset DFU and SWD/BLE_DFU_REQ
BLE_EN: sheet MCU clocks reset and straps/BLE_EN, sheet BLE module reset DFU and SWD/BLE_EN
BLE_RX_U1: sheet MCU clocks reset and straps/BLE_RX_U1, sheet BLE module reset DFU and SWD/BLE_RX_U1
BLE_TX_U1: sheet MCU clocks reset and straps/BLE_TX_U1, sheet BLE module reset DFU and SWD/BLE_TX_U1
BOOT0: sheet MCU clocks reset and straps/BOOT0, sheet USB service debug and EOL fixture/BOOT0
CELL_DTR_U16: sheet MCU clocks reset and straps/CELL_DTR_U16, sheet Cellular modem dual SIM and recovery/CELL_DTR_U16
CELL_PWRKEY_CMD: sheet MCU clocks reset and straps/CELL_PWRKEY_CMD, sheet Cellular modem dual SIM and recovery/CELL_PWRKEY_CMD
CELL_RESET_N_CMD: sheet MCU clocks reset and straps/CELL_RESET_N_CMD, sheet Cellular modem dual SIM and recovery/CELL_RESET_N_CMD
CELL_RI_U16: sheet MCU clocks reset and straps/CELL_RI_U16, sheet Cellular modem dual SIM and recovery/CELL_RI_U16
CELL_RX_U16: sheet MCU clocks reset and straps/CELL_RX_U16, sheet Cellular modem dual SIM and recovery/CELL_RX_U16
CELL_STATUS_U16: sheet MCU clocks reset and straps/CELL_STATUS_U16, sheet Cellular modem dual SIM and recovery/CELL_STATUS_U16
CELL_TX_U16: sheet MCU clocks reset and straps/CELL_TX_U16, sheet Cellular modem dual SIM and recovery/CELL_TX_U16
EN_AUX: sheet Power entry and rail interface/EN_AUX, sheet MCU clocks reset and straps/EN_AUX
EN_MODEM: sheet Power entry and rail interface/EN_MODEM, sheet MCU clocks reset and straps/EN_MODEM
FAULT: sheet Power entry and rail interface/FAULT, sheet USB service debug and EOL fixture/FAULT
GND_DIGITAL: sheet Power entry and rail interface/GND_DIGITAL, sheet MCU clocks reset and straps/GND_DIGITAL, sheet PDM audio AAD and microphone harnesses/GND_DIGITAL, sheet GNSS timing antenna and supervisor/GND_DIGITAL, sheet LoRa radio control and conducted RF/GND_DIGITAL, sheet BLE module reset DFU and SWD/GND_DIGITAL, sheet Storage sensors microSD and tamper/GND_DIGITAL, sheet USB service debug and EOL fixture/GND_DIGITAL
GND_MIC: sheet Power entry and rail interface/GND_MIC, sheet PDM audio AAD and microphone harnesses/GND_MIC
GND_MODEM: sheet Power entry and rail interface/GND_MODEM, sheet Cellular modem dual SIM and recovery/GND_MODEM
GNSS_PPS_U1: sheet MCU clocks reset and straps/GNSS_PPS_U1, sheet GNSS timing antenna and supervisor/GNSS_PPS_U1
GNSS_RX_U1: sheet MCU clocks reset and straps/GNSS_RX_U1, sheet GNSS timing antenna and supervisor/GNSS_RX_U1
GNSS_TX_U1: sheet MCU clocks reset and straps/GNSS_TX_U1, sheet GNSS timing antenna and supervisor/GNSS_TX_U1
I2C2_SCL_BUS: sheet Power entry and rail interface/I2C2_SCL_BUS, sheet Storage sensors microSD and tamper/I2C2_SCL_BUS, sheet USB service debug and EOL fixture/I2C2_SCL_BUS
I2C2_SCL_U1: sheet MCU clocks reset and straps/I2C2_SCL_U1, sheet Storage sensors microSD and tamper/I2C2_SCL_U1
I2C2_SDA_BUS: sheet Power entry and rail interface/I2C2_SDA_BUS, sheet Storage sensors microSD and tamper/I2C2_SDA_BUS, sheet USB service debug and EOL fixture/I2C2_SDA_BUS
I2C2_SDA_U1: sheet MCU clocks reset and straps/I2C2_SDA_U1, sheet Storage sensors microSD and tamper/I2C2_SDA_U1
LORA_BUSY: sheet MCU clocks reset and straps/LORA_BUSY, sheet LoRa radio control and conducted RF/LORA_BUSY
LORA_DIO1: sheet MCU clocks reset and straps/LORA_DIO1, sheet LoRa radio control and conducted RF/LORA_DIO1
LORA_MISO_U1: sheet MCU clocks reset and straps/LORA_MISO_U1, sheet LoRa radio control and conducted RF/LORA_MISO_U1
LORA_MOSI_U1: sheet MCU clocks reset and straps/LORA_MOSI_U1, sheet LoRa radio control and conducted RF/LORA_MOSI_U1
LORA_NSS_U1: sheet MCU clocks reset and straps/LORA_NSS_U1, sheet LoRa radio control and conducted RF/LORA_NSS_U1
LORA_RESET_N: sheet MCU clocks reset and straps/LORA_RESET_N, sheet LoRa radio control and conducted RF/LORA_RESET_N
LORA_RXEN: sheet MCU clocks reset and straps/LORA_RXEN, sheet LoRa radio control and conducted RF/LORA_RXEN
LORA_SCK_U1: sheet MCU clocks reset and straps/LORA_SCK_U1, sheet LoRa radio control and conducted RF/LORA_SCK_U1
LORA_TXEN: sheet MCU clocks reset and straps/LORA_TXEN, sheet LoRa radio control and conducted RF/LORA_TXEN
MIC_WAKE: sheet MCU clocks reset and straps/MIC_WAKE, sheet PDM audio AAD and microphone harnesses/MIC_WAKE
NOR_CLK_U1: sheet MCU clocks reset and straps/NOR_CLK_U1, sheet Storage sensors microSD and tamper/NOR_CLK_U1
NOR_IO0_U1: sheet MCU clocks reset and straps/NOR_IO0_U1, sheet Storage sensors microSD and tamper/NOR_IO0_U1
NOR_IO1_U1: sheet MCU clocks reset and straps/NOR_IO1_U1, sheet Storage sensors microSD and tamper/NOR_IO1_U1
NOR_IO2_U1: sheet MCU clocks reset and straps/NOR_IO2_U1, sheet Storage sensors microSD and tamper/NOR_IO2_U1
NOR_IO3_U1: sheet MCU clocks reset and straps/NOR_IO3_U1, sheet Storage sensors microSD and tamper/NOR_IO3_U1
NOR_NCS_U2: sheet MCU clocks reset and straps/NOR_NCS_U2, sheet Storage sensors microSD and tamper/NOR_NCS_U2
NRST: sheet MCU clocks reset and straps/NRST, sheet USB service debug and EOL fixture/NRST
PDM_CLK: sheet MCU clocks reset and straps/PDM_CLK, sheet PDM audio AAD and microphone harnesses/PDM_CLK
PDM_DATA1: sheet MCU clocks reset and straps/PDM_DATA1, sheet PDM audio AAD and microphone harnesses/PDM_DATA1
PDM_DATA2: sheet MCU clocks reset and straps/PDM_DATA2, sheet PDM audio AAD and microphone harnesses/PDM_DATA2
PDM_DATA3: sheet MCU clocks reset and straps/PDM_DATA3, sheet PDM audio AAD and microphone harnesses/PDM_DATA3
PDM_DATA4: sheet MCU clocks reset and straps/PDM_DATA4, sheet PDM audio AAD and microphone harnesses/PDM_DATA4
PWR_FAULT: sheet Power entry and rail interface/PWR_FAULT, sheet MCU clocks reset and straps/PWR_FAULT
PWR_GOOD: sheet Power entry and rail interface/PWR_GOOD, sheet MCU clocks reset and straps/PWR_GOOD, sheet USB service debug and EOL fixture/PWR_GOOD
REV_STRAP0: sheet MCU clocks reset and straps/REV_STRAP0, sheet USB service debug and EOL fixture/REV_STRAP0
REV_STRAP1: sheet MCU clocks reset and straps/REV_STRAP1, sheet USB service debug and EOL fixture/REV_STRAP1
SD_CK_U1: sheet MCU clocks reset and straps/SD_CK_U1, sheet Storage sensors microSD and tamper/SD_CK_U1
SD_CMD_U1: sheet MCU clocks reset and straps/SD_CMD_U1, sheet Storage sensors microSD and tamper/SD_CMD_U1
SD_D0_U1: sheet MCU clocks reset and straps/SD_D0_U1, sheet Storage sensors microSD and tamper/SD_D0_U1
SD_D1_U1: sheet MCU clocks reset and straps/SD_D1_U1, sheet Storage sensors microSD and tamper/SD_D1_U1
SD_D2_U1: sheet MCU clocks reset and straps/SD_D2_U1, sheet Storage sensors microSD and tamper/SD_D2_U1
SD_D3_U1: sheet MCU clocks reset and straps/SD_D3_U1, sheet Storage sensors microSD and tamper/SD_D3_U1
SD_DET: sheet MCU clocks reset and straps/SD_DET, sheet Storage sensors microSD and tamper/SD_DET
SIM1_DET: sheet MCU clocks reset and straps/SIM1_DET, sheet Cellular modem dual SIM and recovery/SIM1_DET
SIM2_DET: sheet MCU clocks reset and straps/SIM2_DET, sheet Cellular modem dual SIM and recovery/SIM2_DET
SIM_MUX_EN: sheet MCU clocks reset and straps/SIM_MUX_EN, sheet Cellular modem dual SIM and recovery/SIM_MUX_EN
SIM_MUX_SEL: sheet MCU clocks reset and straps/SIM_MUX_SEL, sheet Cellular modem dual SIM and recovery/SIM_MUX_SEL
SWCLK: sheet MCU clocks reset and straps/SWCLK, sheet USB service debug and EOL fixture/SWCLK
SWDIO: sheet MCU clocks reset and straps/SWDIO, sheet USB service debug and EOL fixture/SWDIO
TAMPER_IN_U1: sheet MCU clocks reset and straps/TAMPER_IN_U1, sheet Storage sensors microSD and tamper/TAMPER_IN_U1
TEST_UART_RX_U1: sheet MCU clocks reset and straps/TEST_UART_RX_U1, sheet USB service debug and EOL fixture/TEST_UART_RX_U1
TEST_UART_TX_U1: sheet MCU clocks reset and straps/TEST_UART_TX_U1, sheet USB service debug and EOL fixture/TEST_UART_TX_U1
USB_DM_U1: sheet MCU clocks reset and straps/USB_DM_U1, sheet USB service debug and EOL fixture/USB_DM_U1
USB_DP_U1: sheet MCU clocks reset and straps/USB_DP_U1, sheet USB service debug and EOL fixture/USB_DP_U1
USB_VBUS_SENSE: sheet MCU clocks reset and straps/USB_VBUS_SENSE, sheet USB service debug and EOL fixture/USB_VBUS_SENSE

### Notes on the sheet
- Hierarchy-only engineering candidate. Signed Review-A pin/net authority is retained; routing, DRC, DFM, Review B and manufacture remain prohibited.
- Sheet: Power entry and rail interface
- Sheet: GNSS timing antenna and supervisor
- Sheet: BLE module reset DFU and SWD
- File: PCB-MAIN_01_POWER.kicad_sch.sch
- File: PCB-MAIN_04_GNSS.kicad_sch.sch
- File: PCB-MAIN_07_BLE.kicad_sch.sch
- Sheet: MCU clocks reset and straps
- Sheet: Cellular modem dual SIM and recovery
- Sheet: Storage sensors microSD and tamper
- File: PCB-MAIN_02_MCU.kicad_sch.sch
- File: PCB-MAIN_05_CELLULAR.kicad_sch.sch
- File: PCB-MAIN_08_STORAGE_SENSORS.kicad_sch.sch
- Sheet: PDM audio AAD and microphone harnesses
- Sheet: LoRa radio control and conducted RF
- Sheet: USB service debug and EOL fixture
- File: PCB-MAIN_03_AUDIO.kicad_sch.sch
- File: PCB-MAIN_06_LORA.kicad_sch.sch
- File: PCB-MAIN_09_CONNECTORS_TEST.kicad_sch.sch
- 1
- 2
- 3
- 4
- 5
- 6
- 7
- 8
- 9
- 10
- 11
- A
- B
- C
- D
- E
- F
- G
- H
- Human-readable hierarchy candidate; exact Review-A pin/net equivalence enforced
- Root sheet 1 of 10
- NOT FOR MANUFACTURE - hierarchy review/routing/DRC/DFM/Review B pending
- Title: Dioneya PCB-MAIN Rev.A - System overview
- File: PCB-MAIN.kicad_sch
- Sheet: /
- Dioneya / ZS-BPLA
- KiCad E.D.A.  kicad (5.1.4)-1
- Size: A2
- Date: 2026-09-16
- Rev: A
- Id: 1/1

## Sheet PCB-MAIN_01_POWER.SchDoc
size 594 x 420 mm
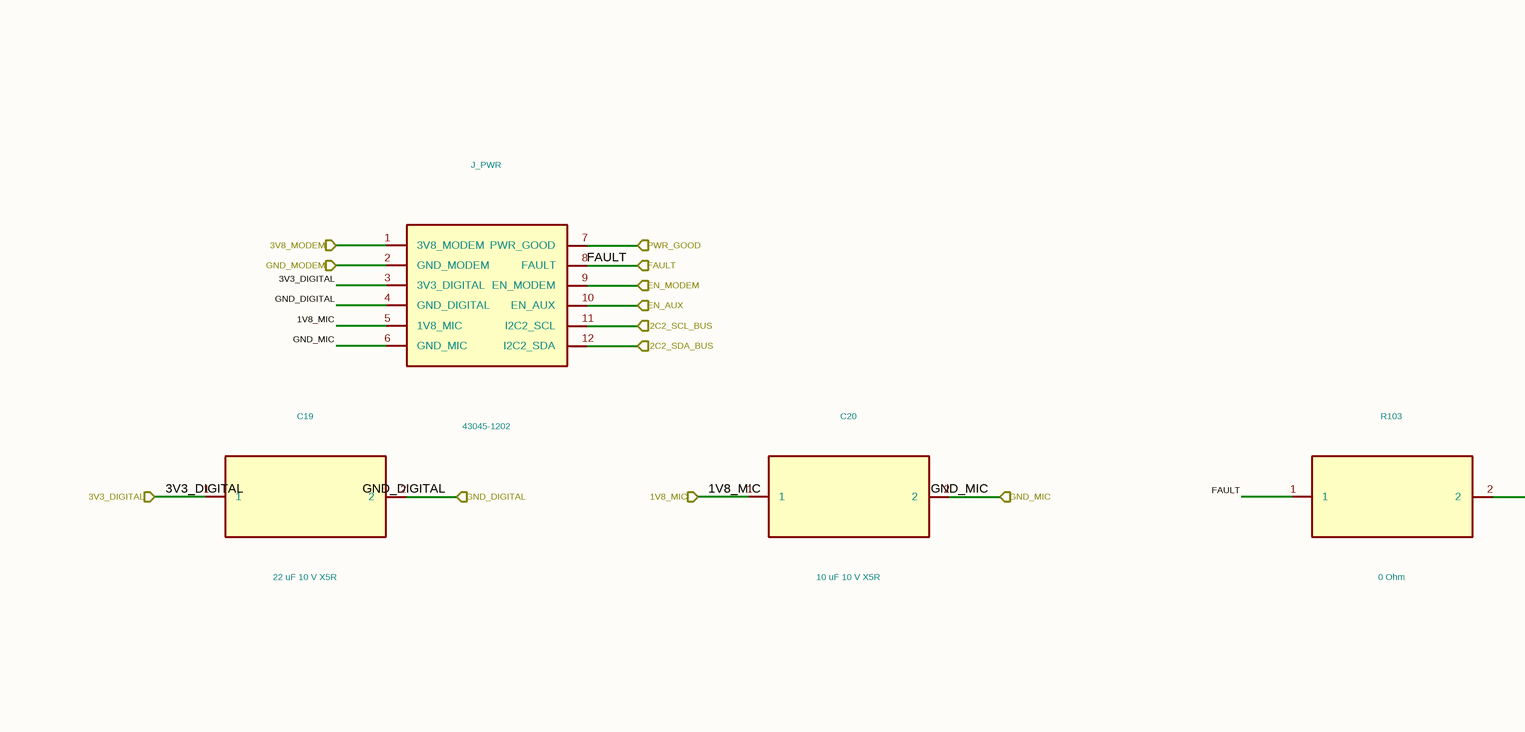
[diagram p12: PCB-MAIN_01_POWER.SchDoc, top left]
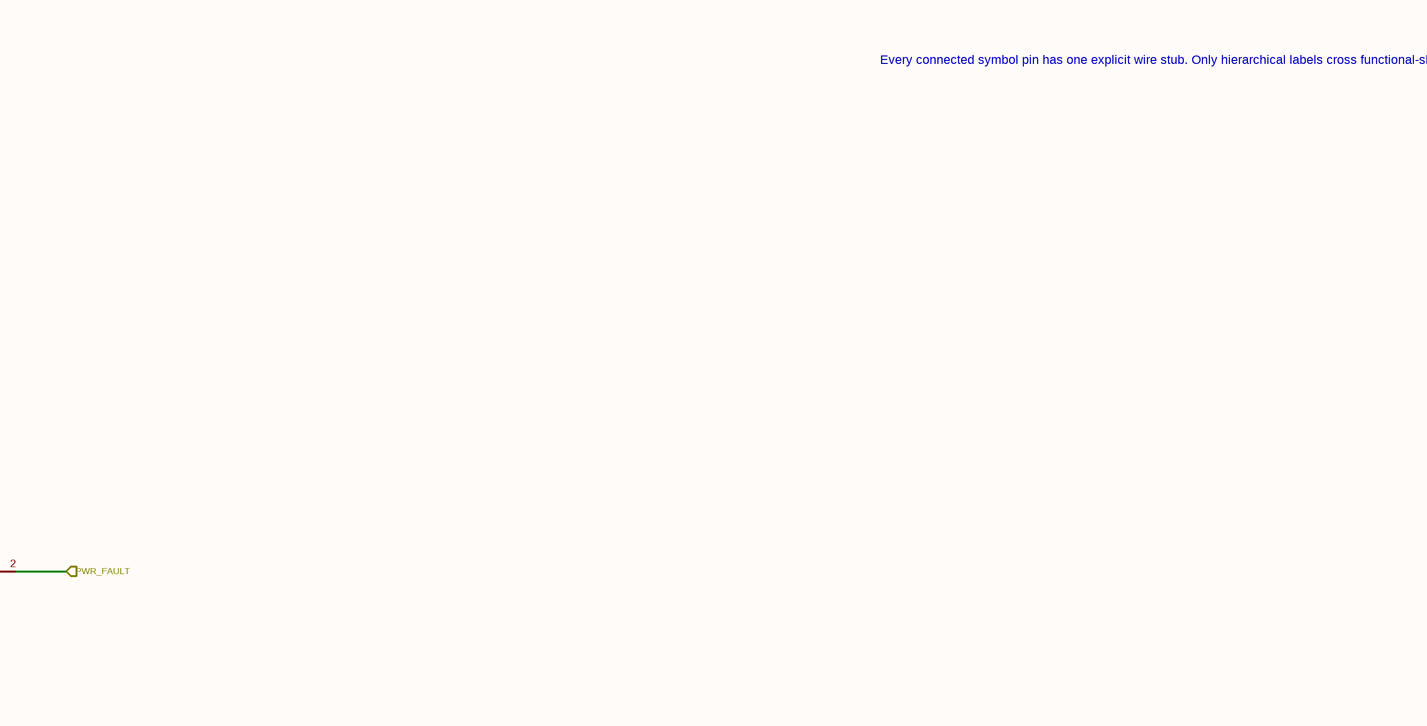
[diagram p13: PCB-MAIN_01_POWER.SchDoc, top right]
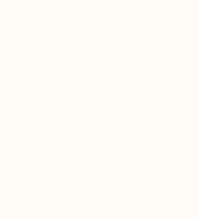
[diagram p14: PCB-MAIN_01_POWER.SchDoc, bottom left]

### Parts
C19  22 uF 10 V X5R  [C_0805_2012Metric]
C20  10 uF 10 V X5R  [C_0603_1608Metric]
J_PWR  43045-1202
R103  0 Ohm  [R_0402_1005Metric]

### Ports
1V8_MIC, 3V3_DIGITAL, 3V8_MODEM, EN_AUX, EN_MODEM, FAULT, GND_DIGITAL, GND_MIC, GND_MODEM, I2C2_SCL_BUS, I2C2_SDA_BUS, PWR_FAULT, PWR_GOOD

### Nets
1V8_MIC: C20.1 J_PWR.5(1V8_MIC) ; port 1V8_MIC
3V3_DIGITAL: C19.1 J_PWR.3(3V3_DIGITAL) ; port 3V3_DIGITAL
3V8_MODEM: J_PWR.1(3V8_MODEM) ; port 3V8_MODEM
EN_AUX: J_PWR.10(EN_AUX) ; port EN_AUX
EN_MODEM: J_PWR.9(EN_MODEM) ; port EN_MODEM
FAULT: J_PWR.8(FAULT) R103.1 ; port FAULT
GND_DIGITAL: C19.2 J_PWR.4(GND_DIGITAL) ; port GND_DIGITAL
GND_MIC: C20.2 J_PWR.6(GND_MIC) ; port GND_MIC
GND_MODEM: J_PWR.2(GND_MODEM) ; port GND_MODEM
I2C2_SCL_BUS: J_PWR.11(I2C2_SCL) ; port I2C2_SCL_BUS
I2C2_SDA_BUS: J_PWR.12(I2C2_SDA) ; port I2C2_SDA_BUS
PWR_FAULT: R103.2 ; port PWR_FAULT
PWR_GOOD: J_PWR.7(PWR_GOOD) ; port PWR_GOOD

### Notes on the sheet
- Every connected symbol pin has one explicit wire stub. Only hierarchical labels cross functional-sheet boundaries.
- 1
- 2
- 3
- 4
- 5
- 6
- 7
- 8
- 9
- 10
- 11
- A
- B
- C
- D
- E
- F
- G
- H
- Human-readable hierarchy candidate; exact Review-A pin/net equivalence enforced
- Functional sheet 2 of 10
- NOT FOR MANUFACTURE - hierarchy review/routing/DRC/DFM/Review B pending
- Title: Dioneya PCB-MAIN Rev.A - Power
- File: PCB-MAIN_01_POWER.kicad_sch
- Sheet: /
- Dioneya / ZS-BPLA
- KiCad E.D.A.  kicad (5.1.4)-1
- Size: A2
- Date: 2026-09-16
- Rev: A
- Id: 1/1

### Library data of the parts
C19 = C19_GRM21BR61A226ME44L: Manufacturer: Murata; Population: FITTED; Authority: PROJECT_MAIN_AUTH_010; MPN: GRM21BR61A226ME44L; Package: 0805; Value: 22 uF 10 V X5R; Footprint: Capacitor_SMD:C_0805_2012Metric
C20 = C20_GRM188R61A106KE69D: Manufacturer: Murata; Population: FITTED; Authority: PROJECT_MAIN_AUTH_010; MPN: GRM188R61A106KE69D; Package: 0603; Value: 10 uF 10 V X5R; Footprint: Capacitor_SMD:C_0603_1608Metric
J_PWR = J_PWR_43045-1202: Manufacturer: Molex; Population: FITTED; Authority: HARNESS_LOGICAL_PINOUT_REV_A.csv; MPN: 43045-1202; Package: Micro-Fit_3.0_2x06_Right_Angle; Value: 43045-1202
R103 = R103_ERJ-2GE0R00X: Manufacturer: Panasonic; Population: FITTED; Authority: PROJECT_MAIN_AUTH_010; MPN: ERJ-2GE0R00X; Package: 0402; Value: 0 Ohm; Footprint: Resistor_SMD:R_0402_1005Metric

## Sheet PCB-MAIN_02_MCU.SchDoc
size 594 x 420 mm
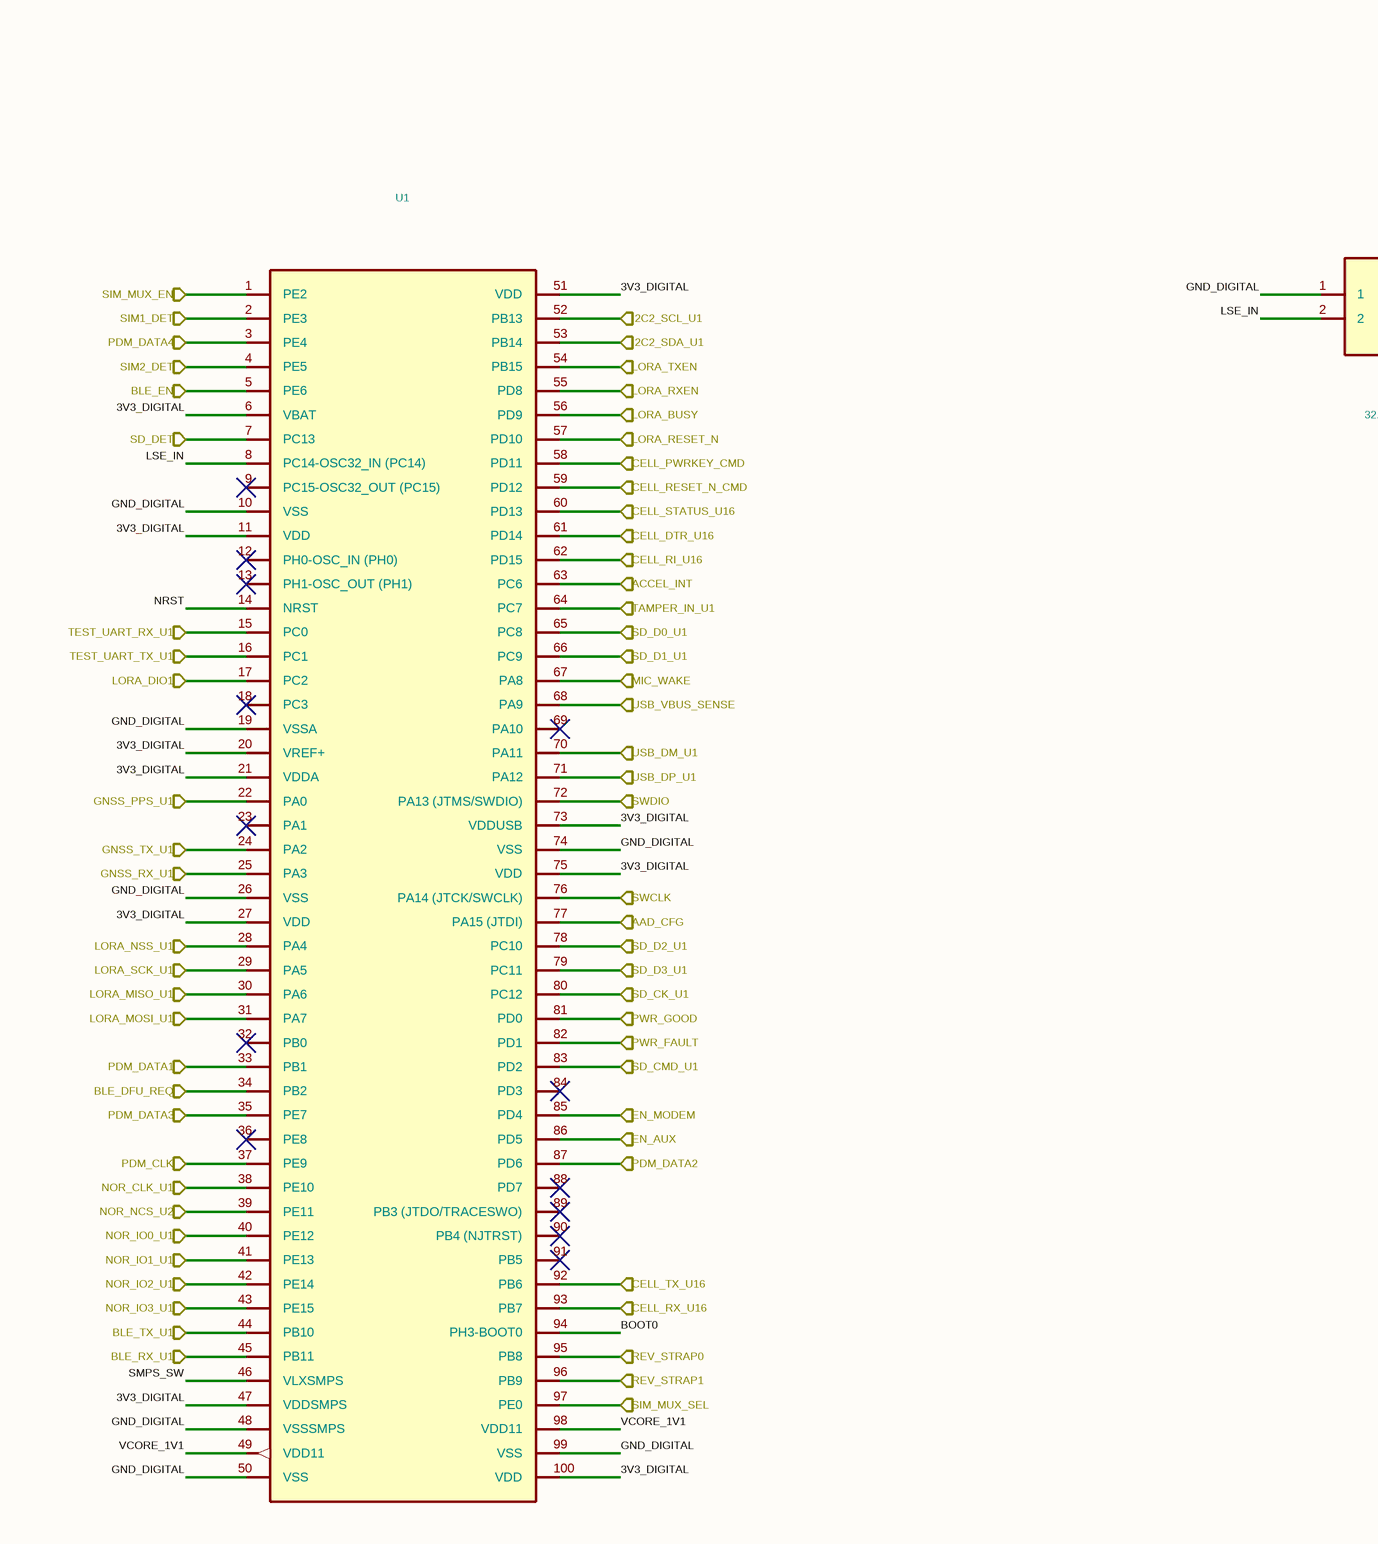
[diagram p15: PCB-MAIN_02_MCU.SchDoc, top left]
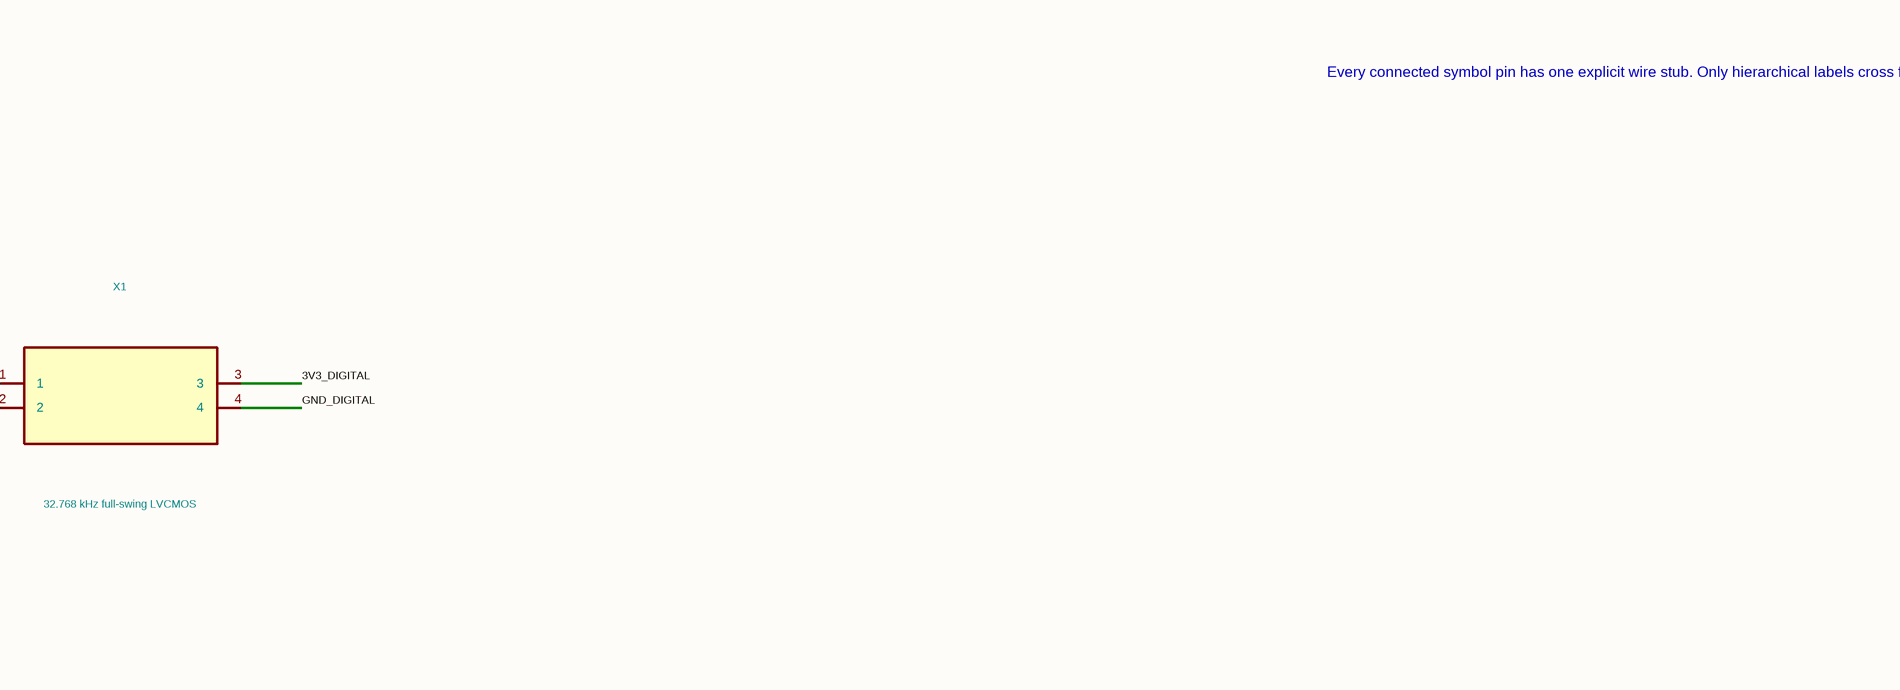
[diagram p16: PCB-MAIN_02_MCU.SchDoc, top middle]
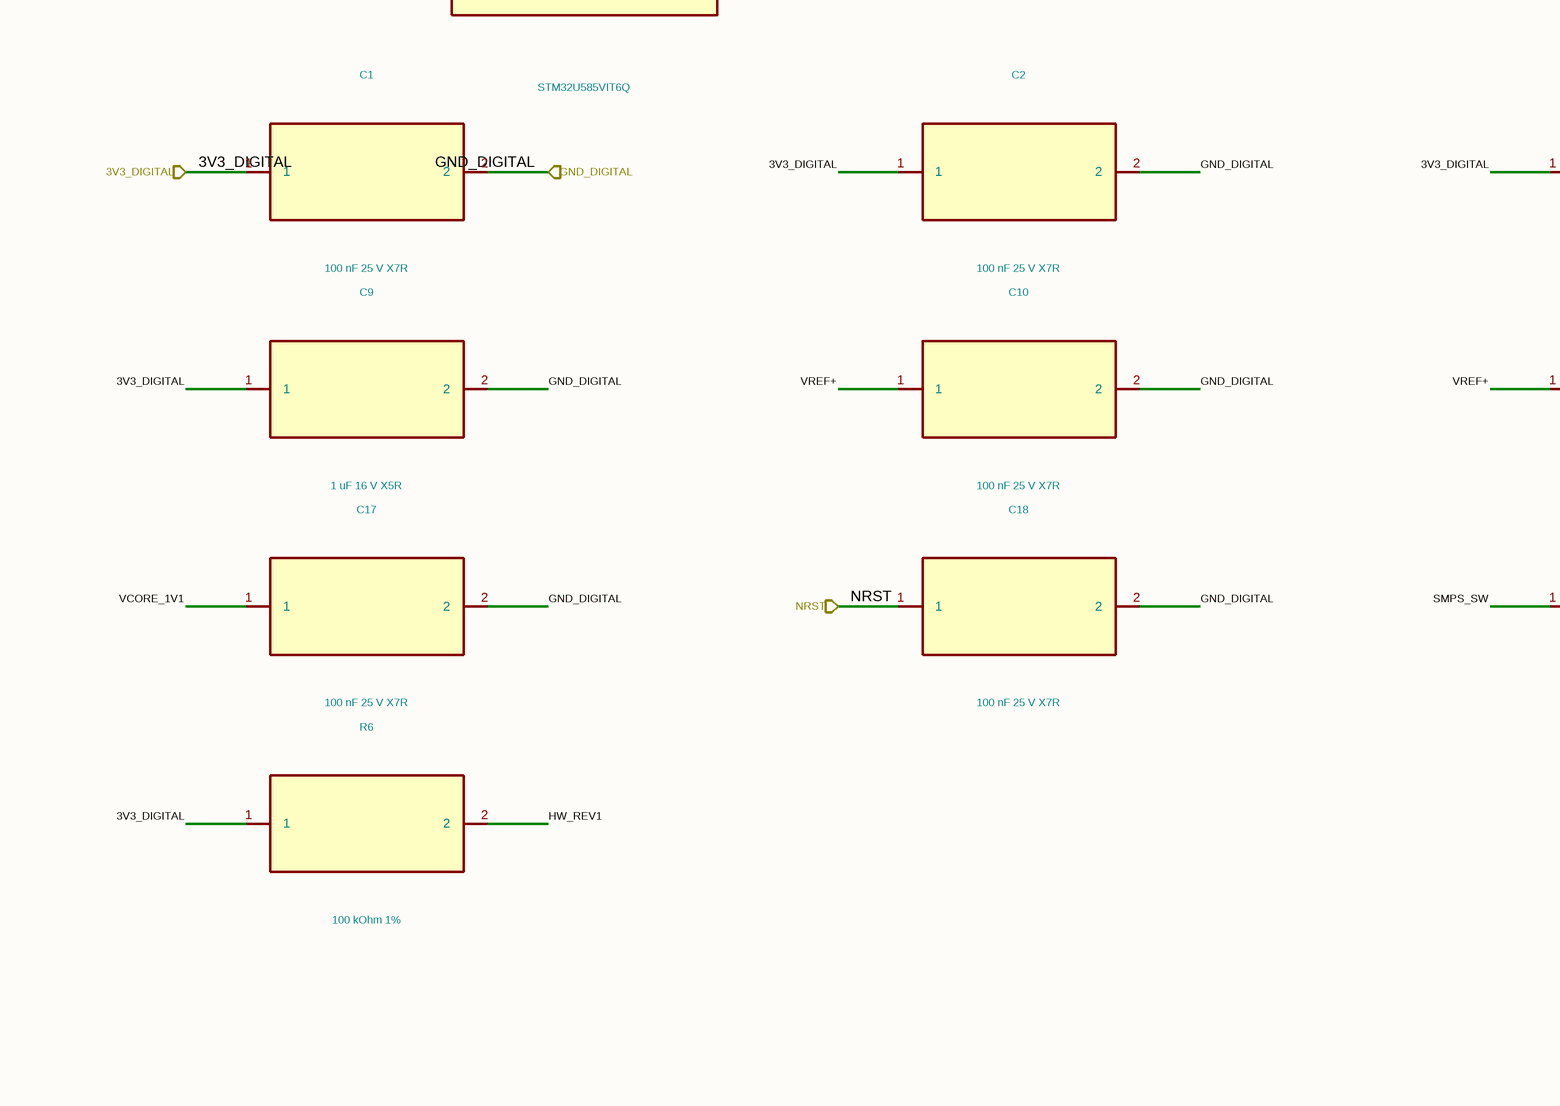
[diagram p17: PCB-MAIN_02_MCU.SchDoc, centre left]
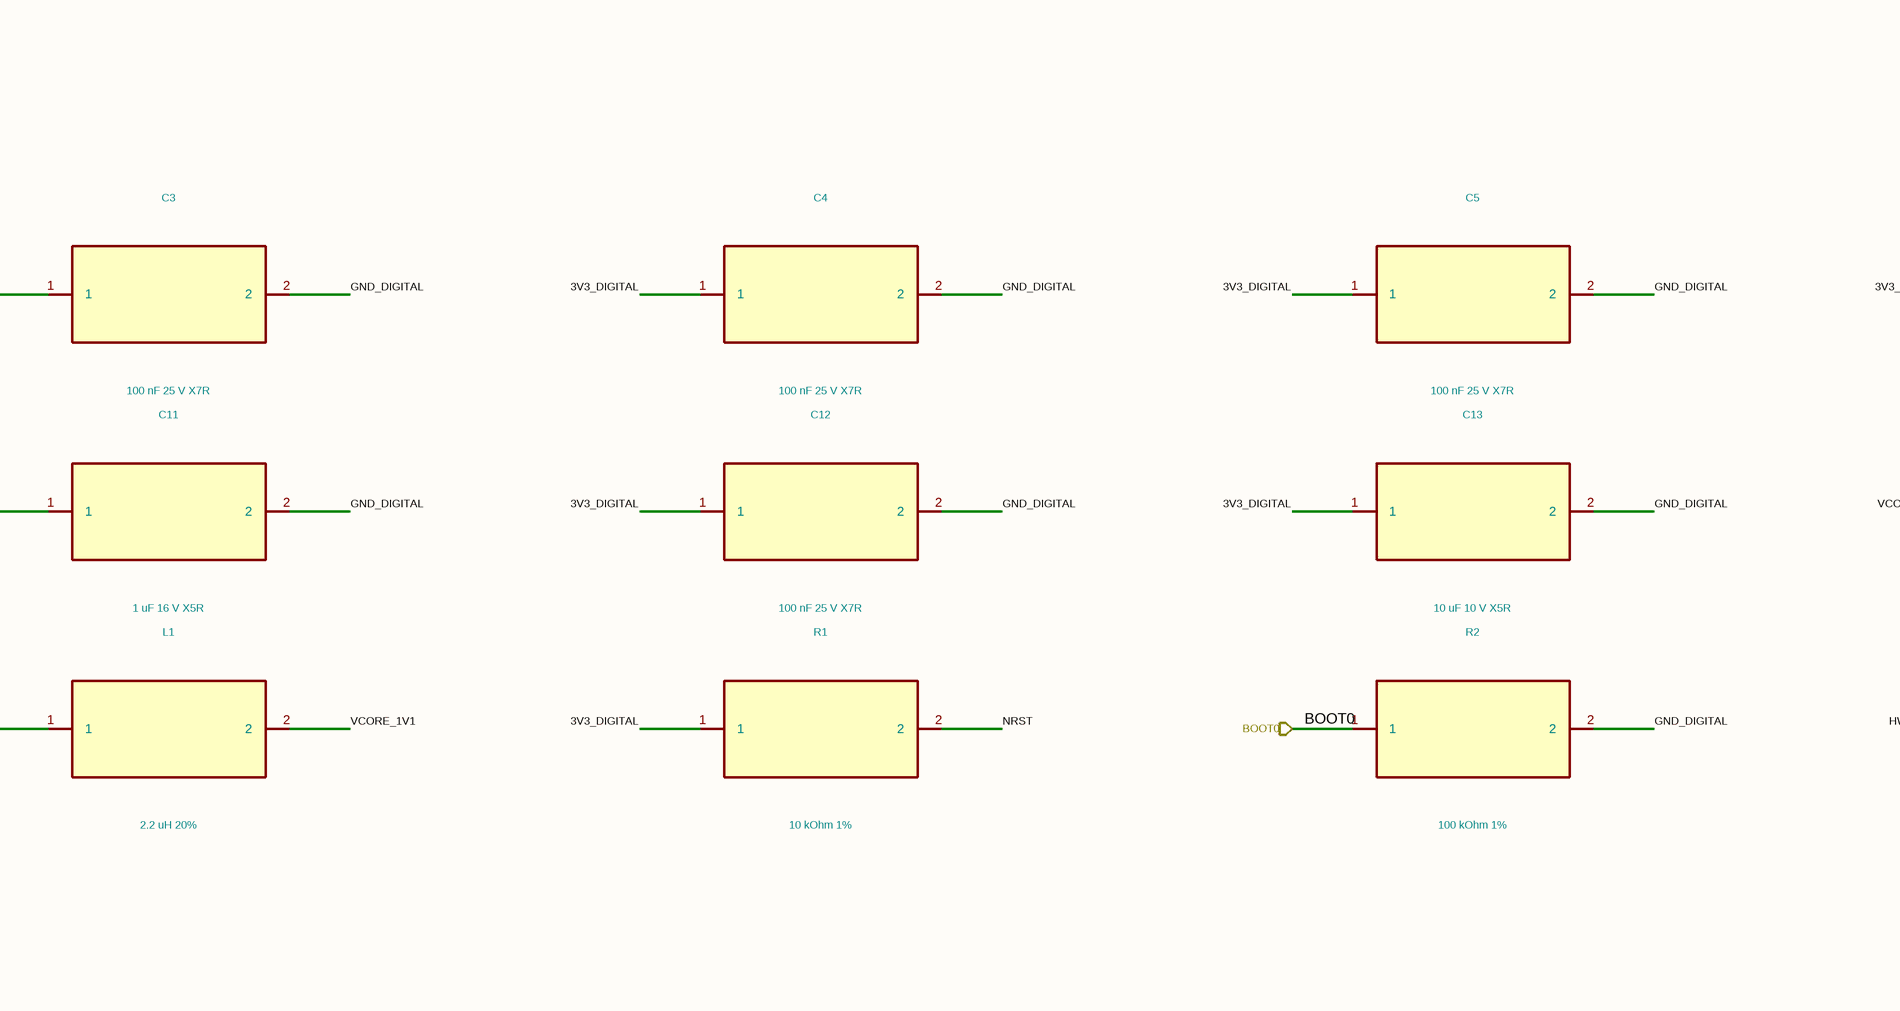
[diagram p18: PCB-MAIN_02_MCU.SchDoc, centre middle]
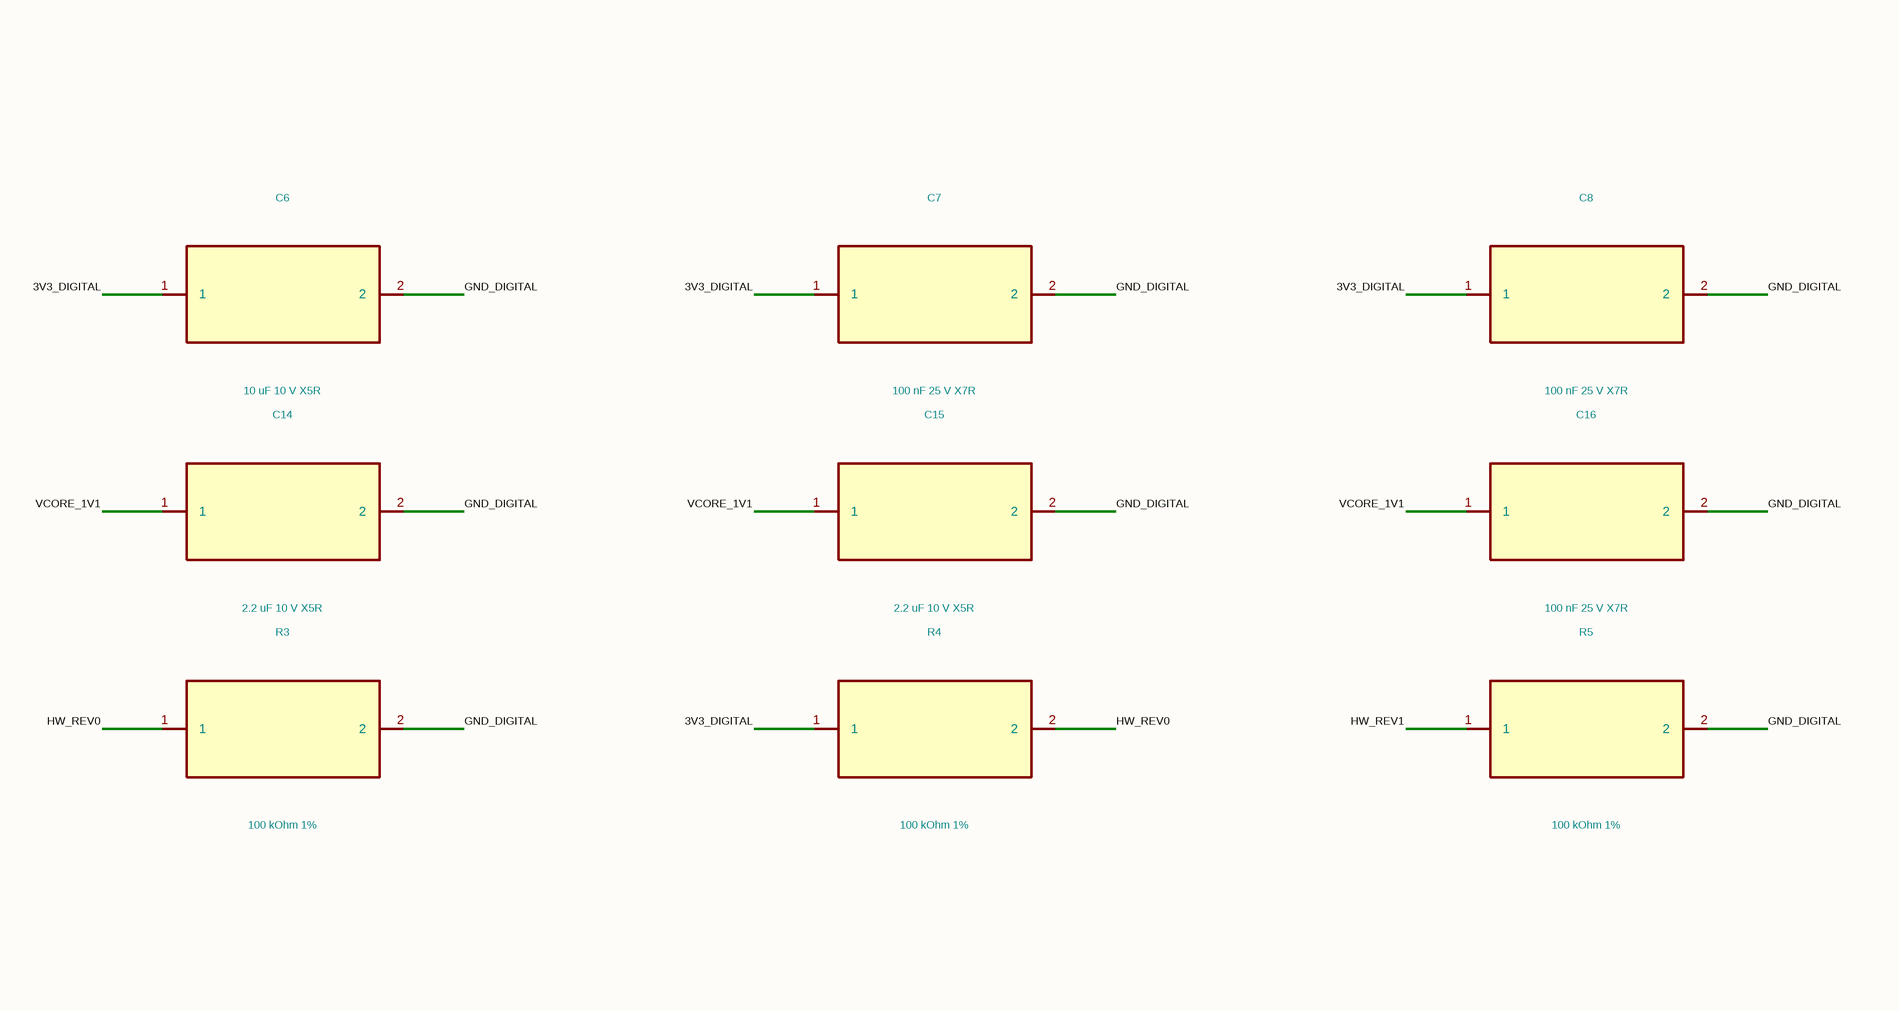
[diagram p19: PCB-MAIN_02_MCU.SchDoc, centre right]
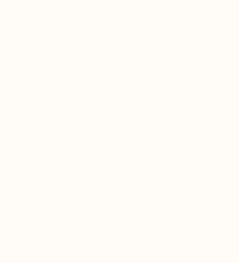
[diagram p20: PCB-MAIN_02_MCU.SchDoc, bottom left]

### Parts
C1  100 nF 25 V X7R  [C_0402_1005Metric]
C2  100 nF 25 V X7R  [C_0402_1005Metric]
C3  100 nF 25 V X7R  [C_0402_1005Metric]
C4  100 nF 25 V X7R  [C_0402_1005Metric]
C5  100 nF 25 V X7R  [C_0402_1005Metric]
C6  10 uF 10 V X5R  [C_0603_1608Metric]
C7  100 nF 25 V X7R  [C_0402_1005Metric]
C8  100 nF 25 V X7R  [C_0402_1005Metric]
C9  1 uF 16 V X5R  [C_0402_1005Metric]
C10  100 nF 25 V X7R  [C_0402_1005Metric]
C11  1 uF 16 V X5R  [C_0402_1005Metric]
C12  100 nF 25 V X7R  [C_0402_1005Metric]
C13  10 uF 10 V X5R  [C_0603_1608Metric]
C14  2.2 uF 10 V X5R  [C_0402_1005Metric]
C15  2.2 uF 10 V X5R  [C_0402_1005Metric]
C16  100 nF 25 V X7R  [C_0402_1005Metric]
C17  100 nF 25 V X7R  [C_0402_1005Metric]
C18  100 nF 25 V X7R  [C_0402_1005Metric]
L1  2.2 uH 20%  [L_1210_3225Metric]
R1  10 kOhm 1%  [R_0402_1005Metric]
R2  100 kOhm 1%  [R_0402_1005Metric]
R3  100 kOhm 1%  [R_0402_1005Metric]
R4  100 kOhm 1%  [R_0402_1005Metric]
R5  100 kOhm 1%  [R_0402_1005Metric]
R6  100 kOhm 1%  [R_0402_1005Metric]
U1  STM32U585VIT6Q
X1  32.768 kHz full-swing LVCMOS

### Ports
3V3_DIGITAL, AAD_CFG, ACCEL_INT, BLE_DFU_REQ, BLE_EN, BLE_RX_U1, BLE_TX_U1, BOOT0, CELL_DTR_U16, CELL_PWRKEY_CMD, CELL_RESET_N_CMD, CELL_RI_U16, CELL_RX_U16, CELL_STATUS_U16, CELL_TX_U16, EN_AUX, EN_MODEM, GND_DIGITAL, GNSS_PPS_U1, GNSS_RX_U1, GNSS_TX_U1, I2C2_SCL_U1, I2C2_SDA_U1, LORA_BUSY, LORA_DIO1, LORA_MISO_U1, LORA_MOSI_U1, LORA_NSS_U1, LORA_RESET_N, LORA_RXEN, LORA_SCK_U1, LORA_TXEN, MIC_WAKE, NOR_CLK_U1, NOR_IO0_U1, NOR_IO1_U1, NOR_IO2_U1, NOR_IO3_U1, NOR_NCS_U2, NRST, PDM_CLK, PDM_DATA1, PDM_DATA2, PDM_DATA3, PDM_DATA4, PWR_FAULT, PWR_GOOD, REV_STRAP0, REV_STRAP1, SD_CK_U1, SD_CMD_U1, SD_D0_U1, SD_D1_U1, SD_D2_U1, SD_D3_U1, SD_DET, SIM1_DET, SIM2_DET, SIM_MUX_EN, SIM_MUX_SEL, SWCLK, SWDIO, TAMPER_IN_U1, TEST_UART_RX_U1, TEST_UART_TX_U1, USB_DM_U1, USB_DP_U1, USB_VBUS_SENSE

### Nets
3V3_DIGITAL: C1.1 C2.1 C3.1 C4.1 C5.1 C6.1 C7.1 C8.1 C9.1 C12.1 C13.1 R1.1 R4.1 R6.1 U1.6(VBAT) U1.11(VDD) U1.20(VREF+) U1.21(VDDA) U1.27(VDD) U1.47(VDDSMPS) U1.51(VDD) U1.73(VDDUSB) U1.75(VDD) U1.100(VDD) X1.3 ; port 3V3_DIGITAL
AAD_CFG: U1.77(PA15_(JTDI)) ; port AAD_CFG
ACCEL_INT: U1.63(PC6) ; port ACCEL_INT
BLE_DFU_REQ: U1.34(PB2) ; port BLE_DFU_REQ
BLE_EN: U1.5(PE6) ; port BLE_EN
BLE_RX_U1: U1.45(PB11) ; port BLE_RX_U1
BLE_TX_U1: U1.44(PB10) ; port BLE_TX_U1
BOOT0: R2.1 U1.94(PH3-BOOT0) ; port BOOT0
CELL_DTR_U16: U1.61(PD14) ; port CELL_DTR_U16
CELL_PWRKEY_CMD: U1.58(PD11) ; port CELL_PWRKEY_CMD
CELL_RESET_N_CMD: U1.59(PD12) ; port CELL_RESET_N_CMD
CELL_RI_U16: U1.62(PD15) ; port CELL_RI_U16
CELL_RX_U16: U1.93(PB7) ; port CELL_RX_U16
CELL_STATUS_U16: U1.60(PD13) ; port CELL_STATUS_U16
CELL_TX_U16: U1.92(PB6) ; port CELL_TX_U16
EN_AUX: U1.86(PD5) ; port EN_AUX
EN_MODEM: U1.85(PD4) ; port EN_MODEM
GND_DIGITAL: C1.2 C2.2 C3.2 C4.2 C5.2 C6.2 C7.2 C8.2 C9.2 C10.2 C11.2 C12.2 C13.2 C14.2 C15.2 C16.2 C17.2 C18.2 R2.2 R3.2 R5.2 U1.10(VSS) U1.19(VSSA) U1.26(VSS) U1.48(VSSSMPS) U1.50(VSS) U1.74(VSS) U1.99(VSS) X1.1 X1.4 ; port GND_DIGITAL
GNSS_PPS_U1: U1.22(PA0) ; port GNSS_PPS_U1
GNSS_RX_U1: U1.25(PA3) ; port GNSS_RX_U1
GNSS_TX_U1: U1.24(PA2) ; port GNSS_TX_U1
HW_REV0: R3.1 R4.2
HW_REV1: R5.1 R6.2
I2C2_SCL_U1: U1.52(PB13) ; port I2C2_SCL_U1
I2C2_SDA_U1: U1.53(PB14) ; port I2C2_SDA_U1
LORA_BUSY: U1.56(PD9) ; port LORA_BUSY
LORA_DIO1: U1.17(PC2) ; port LORA_DIO1
LORA_MISO_U1: U1.30(PA6) ; port LORA_MISO_U1
LORA_MOSI_U1: U1.31(PA7) ; port LORA_MOSI_U1
LORA_NSS_U1: U1.28(PA4) ; port LORA_NSS_U1
LORA_RESET_N: U1.57(PD10) ; port LORA_RESET_N
LORA_RXEN: U1.55(PD8) ; port LORA_RXEN
LORA_SCK_U1: U1.29(PA5) ; port LORA_SCK_U1
LORA_TXEN: U1.54(PB15) ; port LORA_TXEN
LSE_IN: U1.8(PC14-OSC32_IN_(PC14)) X1.2
MIC_WAKE: U1.67(PA8) ; port MIC_WAKE
NOR_CLK_U1: U1.38(PE10) ; port NOR_CLK_U1
NOR_IO0_U1: U1.40(PE12) ; port NOR_IO0_U1
NOR_IO1_U1: U1.41(PE13) ; port NOR_IO1_U1
NOR_IO2_U1: U1.42(PE14) ; port NOR_IO2_U1
NOR_IO3_U1: U1.43(PE15) ; port NOR_IO3_U1
NOR_NCS_U2: U1.39(PE11) ; port NOR_NCS_U2
NRST: C18.1 R1.2 U1.14(NRST) ; port NRST
PDM_CLK: U1.37(PE9) ; port PDM_CLK
PDM_DATA1: U1.33(PB1) ; port PDM_DATA1
PDM_DATA2: U1.87(PD6) ; port PDM_DATA2
PDM_DATA3: U1.35(PE7) ; port PDM_DATA3
PDM_DATA4: U1.3(PE4) ; port PDM_DATA4
PWR_FAULT: U1.82(PD1) ; port PWR_FAULT
PWR_GOOD: U1.81(PD0) ; port PWR_GOOD
REV_STRAP0: U1.95(PB8) ; port REV_STRAP0
REV_STRAP1: U1.96(PB9) ; port REV_STRAP1
SD_CK_U1: U1.80(PC12) ; port SD_CK_U1
SD_CMD_U1: U1.83(PD2) ; port SD_CMD_U1
SD_D0_U1: U1.65(PC8) ; port SD_D0_U1
SD_D1_U1: U1.66(PC9) ; port SD_D1_U1
SD_D2_U1: U1.78(PC10) ; port SD_D2_U1
SD_D3_U1: U1.79(PC11) ; port SD_D3_U1
SD_DET: U1.7(PC13) ; port SD_DET
SIM1_DET: U1.2(PE3) ; port SIM1_DET
SIM2_DET: U1.4(PE5) ; port SIM2_DET
SIM_MUX_EN: U1.1(PE2) ; port SIM_MUX_EN
SIM_MUX_SEL: U1.97(PE0) ; port SIM_MUX_SEL
SMPS_SW: L1.1 U1.46(VLXSMPS)
SWCLK: U1.76(PA14_(JTCK/SWCLK)) ; port SWCLK
SWDIO: U1.72(PA13_(JTMS/SWDIO)) ; port SWDIO
TAMPER_IN_U1: U1.64(PC7) ; port TAMPER_IN_U1
TEST_UART_RX_U1: U1.15(PC0) ; port TEST_UART_RX_U1
TEST_UART_TX_U1: U1.16(PC1) ; port TEST_UART_TX_U1
USB_DM_U1: U1.70(PA11) ; port USB_DM_U1
USB_DP_U1: U1.71(PA12) ; port USB_DP_U1
USB_VBUS_SENSE: U1.68(PA9) ; port USB_VBUS_SENSE
VCORE_1V1: C14.1 C15.1 C16.1 C17.1 L1.2 U1.49(VDD11) U1.98(VDD11)
VREF+: C10.1 C11.1

Not connected (* = marked no-connect by the designer): U1 9(PC15-OSC32_OUT_(PC15))* 12(PH0-OSC_IN_(PH0))* 13(PH1-OSC_OUT_(PH1))* 18(PC3)* 23(PA1)* 32(PB0)* 36(PE8)* 69(PA10)* 84(PD3)* 88(PD7)* 89(PB3_(JTDO/TRACESWO))* 90(PB4_(NJTRST))* 91(PB5)*

### Notes on the sheet
- Every connected symbol pin has one explicit wire stub. Only hierarchical labels cross functional-sheet boundaries.
- 1
- 2
- 3
- 4
- 5
- 6
- 7
- 8
- 9
- 10
- 11
- A
- B
- C
- D
- E
- F
- G
- H
- Human-readable hierarchy candidate; exact Review-A pin/net equivalence enforced
- Functional sheet 3 of 10
- NOT FOR MANUFACTURE - hierarchy review/routing/DRC/DFM/Review B pending
- Title: Dioneya PCB-MAIN Rev.A - MCU
- File: PCB-MAIN_02_MCU.kicad_sch
- Sheet: /
- Dioneya / ZS-BPLA
- KiCad E.D.A.  kicad (5.1.4)-1
- Size: A2
- Date: 2026-09-16
- Rev: A
- Id: 1/1

### Library data of the parts
C1 = C1_GRM155R71E104KE14D: Manufacturer: Murata; Population: FITTED; Authority: ST_AN5373_Rev7; MPN: GRM155R71E104KE14D; Package: 0402; Value: 100 nF 25 V X7R; Footprint: Capacitor_SMD:C_0402_1005Metric
C2 = C2_GRM155R71E104KE14D: Manufacturer: Murata; Population: FITTED; Authority: ST_AN5373_Rev7; MPN: GRM155R71E104KE14D; Package: 0402; Value: 100 nF 25 V X7R; Footprint: Capacitor_SMD:C_0402_1005Metric
C3 = C3_GRM155R71E104KE14D: Manufacturer: Murata; Population: FITTED; Authority: ST_AN5373_Rev7; MPN: GRM155R71E104KE14D; Package: 0402; Value: 100 nF 25 V X7R; Footprint: Capacitor_SMD:C_0402_1005Metric
C4 = C4_GRM155R71E104KE14D: Manufacturer: Murata; Population: FITTED; Authority: ST_AN5373_Rev7; MPN: GRM155R71E104KE14D; Package: 0402; Value: 100 nF 25 V X7R; Footprint: Capacitor_SMD:C_0402_1005Metric
C5 = C5_GRM155R71E104KE14D: Manufacturer: Murata; Population: FITTED; Authority: ST_AN5373_Rev7; MPN: GRM155R71E104KE14D; Package: 0402; Value: 100 nF 25 V X7R; Footprint: Capacitor_SMD:C_0402_1005Metric
C6 = C6_GRM188R61A106KE69D: Manufacturer: Murata; Population: FITTED; Authority: ST_AN5373_Rev7; MPN: GRM188R61A106KE69D; Package: 0603; Value: 10 uF 10 V X5R; Footprint: Capacitor_SMD:C_0603_1608Metric
C7 = C7_GRM155R71E104KE14D: Manufacturer: Murata; Population: FITTED; Authority: ST_AN5373_Rev7; MPN: GRM155R71E104KE14D; Package: 0402; Value: 100 nF 25 V X7R; Footprint: Capacitor_SMD:C_0402_1005Metric
C8 = C8_GRM155R71E104KE14D: Manufacturer: Murata; Population: FITTED; Authority: ST_AN5373_Rev7; MPN: GRM155R71E104KE14D; Package: 0402; Value: 100 nF 25 V X7R; Footprint: Capacitor_SMD:C_0402_1005Metric
C9 = C9_GRM155R61C105KA12D: Manufacturer: Murata; Population: FITTED; Authority: ST_AN5373_Rev7; MPN: GRM155R61C105KA12D; Package: 0402; Value: 1 uF 16 V X5R; Footprint: Capacitor_SMD:C_0402_1005Metric
C10 = C10_GRM155R71E104KE14D: Manufacturer: Murata; Population: FITTED; Authority: ST_AN5373_Rev7; MPN: GRM155R71E104KE14D; Package: 0402; Value: 100 nF 25 V X7R; Footprint: Capacitor_SMD:C_0402_1005Metric
C11 = C11_GRM155R61C105KA12D: Manufacturer: Murata; Population: FITTED; Authority: ST_AN5373_Rev7; MPN: GRM155R61C105KA12D; Package: 0402; Value: 1 uF 16 V X5R; Footprint: Capacitor_SMD:C_0402_1005Metric
C12 = C12_GRM155R71E104KE14D: Manufacturer: Murata; Population: FITTED; Authority: ST_AN5373_Rev7; MPN: GRM155R71E104KE14D; Package: 0402; Value: 100 nF 25 V X7R; Footprint: Capacitor_SMD:C_0402_1005Metric
C13 = C13_GRM188R61A106KE69D: Manufacturer: Murata; Population: FITTED; Authority: ST_AN5373_Rev7; MPN: GRM188R61A106KE69D; Package: 0603; Value: 10 uF 10 V X5R; Footprint: Capacitor_SMD:C_0603_1608Metric
C14 = C14_GRM155R61A225KE15D: Manufacturer: Murata; Population: FITTED; Authority: ST_AN5373_Rev7; MPN: GRM155R61A225KE15D; Package: 0402; Value: 2.2 uF 10 V X5R; Footprint: Capacitor_SMD:C_0402_1005Metric
C15 = C15_GRM155R61A225KE15D: Manufacturer: Murata; Population: FITTED; Authority: ST_AN5373_Rev7; MPN: GRM155R61A225KE15D; Package: 0402; Value: 2.2 uF 10 V X5R; Footprint: Capacitor_SMD:C_0402_1005Metric
C16 = C16_GRM155R71E104KE14D: Manufacturer: Murata; Population: DNP; Authority: ST_AN5373_Rev7; MPN: GRM155R71E104KE14D; Package: 0402; Value: 100 nF 25 V X7R; Footprint: Capacitor_SMD:C_0402_1005Metric
C17 = C17_GRM155R71E104KE14D: Manufacturer: Murata; Population: DNP; Authority: ST_AN5373_Rev7; MPN: GRM155R71E104KE14D; Package: 0402; Value: 100 nF 25 V X7R; Footprint: Capacitor_SMD:C_0402_1005Metric
C18 = C18_GRM155R71E104KE14D: Manufacturer: Murata; Population: FITTED; Authority: ST_AN5373_Rev7; MPN: GRM155R71E104KE14D; Package: 0402; Value: 100 nF 25 V X7R; Footprint: Capacitor_SMD:C_0402_1005Metric
L1 = L1_LQH32PN2R2NN0L: Manufacturer: Murata; Population: FITTED; Authority: ST_AN5373_Rev7; MPN: LQH32PN2R2NN0L; Package: 1210; Value: 2.2 uH 20%; Footprint: Inductor_SMD:L_1210_3225Metric
R1 = R1_ERJ-2RKF1002X: Manufacturer: Panasonic; Population: FITTED; Authority: ST_AN5373_Rev7; MPN: ERJ-2RKF1002X; Package: 0402; Value: 10 kOhm 1%; Footprint: Resistor_SMD:R_0402_1005Metric
R2 = R2_ERJ-2RKF1003X: Manufacturer: Panasonic; Population: FITTED; Authority: ST_AN2606; MPN: ERJ-2RKF1003X; Package: 0402; Value: 100 kOhm 1%; Footprint: Resistor_SMD:R_0402_1005Metric
R3 = R3_ERJ-2RKF1003X: Manufacturer: Panasonic; Population: FITTED; Authority: PROJECT_MAIN_AUTH_010; MPN: ERJ-2RKF1003X; Package: 0402; Value: 100 kOhm 1%; Footprint: Resistor_SMD:R_0402_1005Metric
R4 = R4_ERJ-2RKF1003X: Manufacturer: Panasonic; Population: DNP; Authority: PROJECT_MAIN_AUTH_010; MPN: ERJ-2RKF1003X; Package: 0402; Value: 100 kOhm 1%; Footprint: Resistor_SMD:R_0402_1005Metric
R5 = R5_ERJ-2RKF1003X: Manufacturer: Panasonic; Population: FITTED; Authority: PROJECT_MAIN_AUTH_010; MPN: ERJ-2RKF1003X; Package: 0402; Value: 100 kOhm 1%; Footprint: Resistor_SMD:R_0402_1005Metric
R6 = R6_ERJ-2RKF1003X: Manufacturer: Panasonic; Population: DNP; Authority: PROJECT_MAIN_AUTH_010; MPN: ERJ-2RKF1003X; Package: 0402; Value: 100 kOhm 1%; Footprint: Resistor_SMD:R_0402_1005Metric
U1 = U1_STM32U585VIT6Q: Manufacturer: STMicroelectronics; Population: FITTED; Authority: PCB_MAIN_MCU_PIN_AUTHORITY_REV_A.csv; MPN: STM32U585VIT6Q; Package: LQFP100_14x14; Value: STM32U585VIT6Q
X1 = X1_SiT1552AI-JE-DCC-32.768D: Manufacturer: SiTime; Population: FITTED; Authority: SiTime_SiT1552_Rev1.43; MPN: SiT1552AI-JE-DCC-32.768D; Package: CSP-4_1.5x0.8mm; Value: 32.768 kHz full-swing LVCMOS